# EAGLE schematic RGB_IR_J010131revC (EAGLE 7.7.0), part 1 of 2

## Sheet 1 of 4
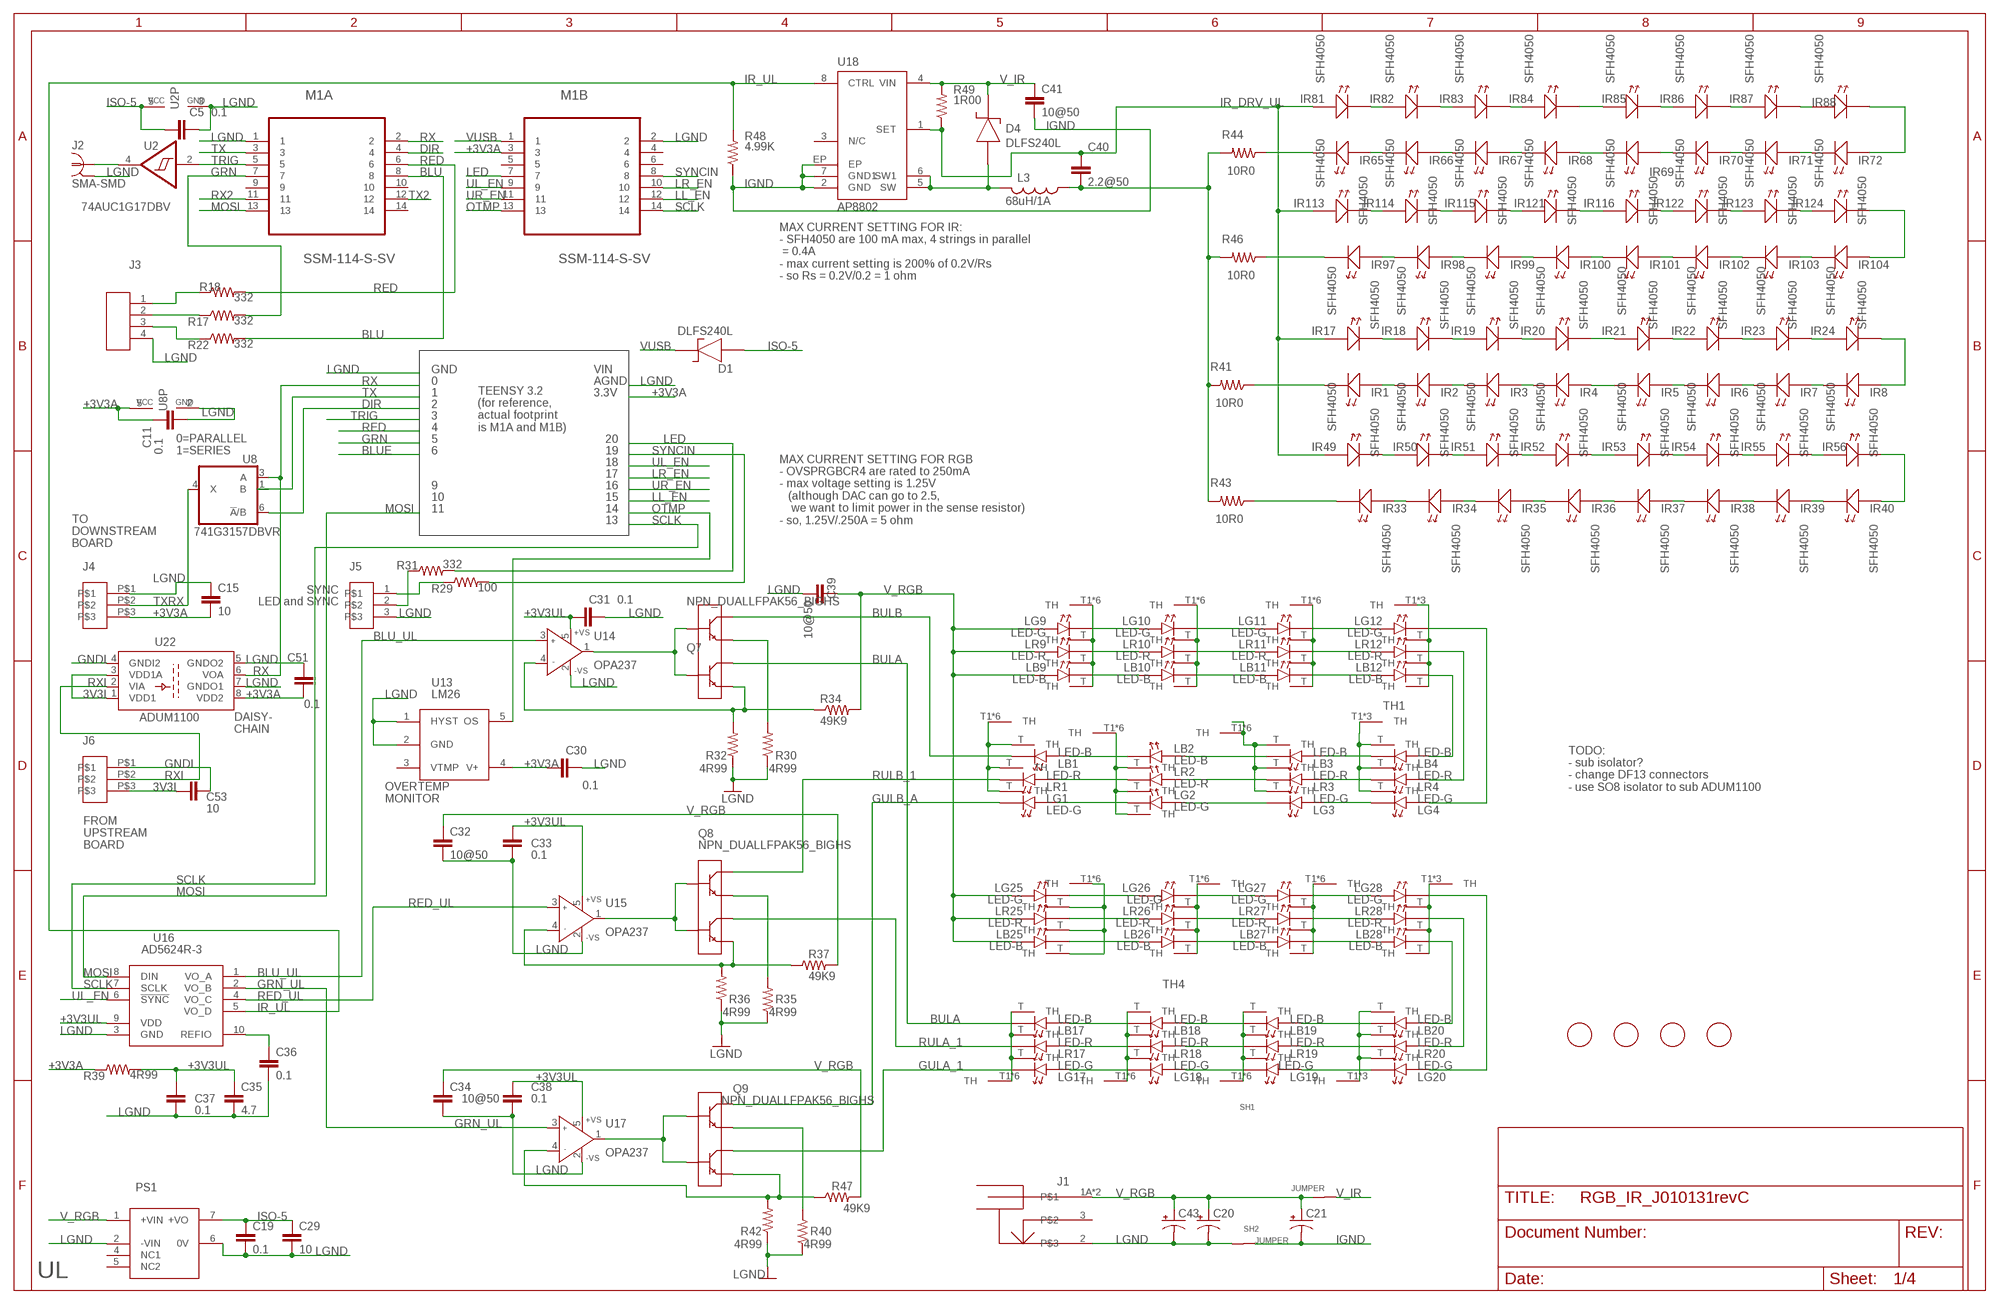
[diagram p0: schematic, sheet 1]

### Parts
C5  0.1  CAPS0603S  [0603S]
C11  0.1  CAPS0603S  [0603S]
C15  10  CAPS1210S  [1210S]
C19  0.1  CAPS0603S  [0603S]
C20  CPOL-US153CLV-0810  [153CLV-0810]
C21  CPOL-US153CLV-0810  [153CLV-0810]
C29  10  CAPS1210S  [1210S]
C30  0.1  CAPS0603S  [0603S]
C31  0.1  CAPS0603S  [0603S]
C32  10@50  CAPS1210S  [1210S]
C33  0.1  CAPS0603S  [0603S]
C34  10@50  CAPS1210S  [1210S]
C35  4.7  CAPS0805S  [0805S]
C36  0.1  CAPS0603S  [0603S]
C37  0.1  CAPS0603S  [0603S]
C38  0.1  CAPS0603S  [0603S]
C39  10@50  CAPS1210S  [1210S]
C40  2.2@50  CAPS1206S  [1206S]
C41  10@50  CAPS1210S  [1210S]
C43  CPOL-US153CLV-0810  [153CLV-0810]
C51  0.1  CAPS0603S  [0603S]
C53  10  CAPS1210S  [1210S]
D1  DLFS240L  DIODE_SCHOTTKYPWRDI-123  [PWRDI-123]
D4  DLFS240L  DIODE_SCHOTTKYPWRDI-123  [PWRDI-123]
FID1  FIDUCIAL  [FIDUCIAL_1MM]
FID2  FIDUCIAL  [FIDUCIAL_1MM]
FID3  FIDUCIAL  [FIDUCIAL_1MM]
FID4  FIDUCIAL  [FIDUCIAL_1MM]
IR1  SFH4050  LEDLED_SFH4050_A  [LED_SFH4045_HEAT_A]
IR2  SFH4050  LEDLED_SFH4050_HEAT  [LED_SFH4050_HEAT]
IR3  SFH4050  LEDLED_SFH4050_HEAT  [LED_SFH4050_HEAT]
IR4  SFH4050  LEDLED_SFH4050_HEAT  [LED_SFH4050_HEAT]
IR5  SFH4050  LEDLED_SFH4050_HEAT  [LED_SFH4050_HEAT]
IR6  SFH4050  LEDLED_SFH4050_HEAT  [LED_SFH4050_HEAT]
IR7  SFH4050  LEDLED_SFH4050_HEAT  [LED_SFH4050_HEAT]
IR8  SFH4050  LEDLED_SFH4050_HEAT  [LED_SFH4050_HEAT]
IR17  SFH4050  LEDLED_SFH4050_HEAT  [LED_SFH4050_HEAT]
IR18  SFH4050  LEDLED_SFH4050_HEAT  [LED_SFH4050_HEAT]
IR19  SFH4050  LEDLED_SFH4050_HEAT  [LED_SFH4050_HEAT]
IR20  SFH4050  LEDLED_SFH4050_HEAT  [LED_SFH4050_HEAT]
IR21  SFH4050  LEDLED_SFH4050_HEAT  [LED_SFH4050_HEAT]
IR22  SFH4050  LEDLED_SFH4050_HEAT  [LED_SFH4050_HEAT]
IR23  SFH4050  LEDLED_SFH4050_HEAT  [LED_SFH4050_HEAT]
IR24  SFH4050  LEDLED_SFH4050_HEAT  [LED_SFH4050_HEAT]
IR33  SFH4050  LEDLED_SFH4050_HEAT  [LED_SFH4050_HEAT]
IR34  SFH4050  LEDLED_SFH4050_HEAT  [LED_SFH4050_HEAT]
IR35  SFH4050  LEDLED_SFH4050_HEAT  [LED_SFH4050_HEAT]
IR36  SFH4050  LEDLED_SFH4050_HEAT  [LED_SFH4050_HEAT]
IR37  SFH4050  LEDLED_SFH4050_HEAT  [LED_SFH4050_HEAT]
IR38  SFH4050  LEDLED_SFH4050_HEAT  [LED_SFH4050_HEAT]
IR39  SFH4050  LEDLED_SFH4050_HEAT  [LED_SFH4050_HEAT]
IR40  SFH4050  LEDLED_SFH4050_HEAT  [LED_SFH4050_HEAT]
IR49  SFH4050  LEDLED_SFH4050_HEAT  [LED_SFH4050_HEAT]
IR50  SFH4050  LEDLED_SFH4050_HEAT  [LED_SFH4050_HEAT]
IR51  SFH4050  LEDLED_SFH4050_HEAT  [LED_SFH4050_HEAT]
IR52  SFH4050  LEDLED_SFH4050_HEAT  [LED_SFH4050_HEAT]
IR53  SFH4050  LEDLED_SFH4050_HEAT  [LED_SFH4050_HEAT]
IR54  SFH4050  LEDLED_SFH4050_HEAT  [LED_SFH4050_HEAT]
IR55  SFH4050  LEDLED_SFH4050_HEAT  [LED_SFH4050_HEAT]
IR56  SFH4050  LEDLED_SFH4050_HEAT  [LED_SFH4050_HEAT]
IR65  SFH4050  LEDLED_SFH4050_HEAT  [LED_SFH4050_HEAT]
IR66  SFH4050  LEDLED_SFH4050_HEAT  [LED_SFH4050_HEAT]
IR67  SFH4050  LEDLED_SFH4050_HEAT  [LED_SFH4050_HEAT]
IR68  SFH4050  LEDLED_SFH4050_HEAT  [LED_SFH4050_HEAT]
IR69  SFH4050  LEDLED_SFH4050_HEAT  [LED_SFH4050_HEAT]
IR70  SFH4050  LEDLED_SFH4050_HEAT  [LED_SFH4050_HEAT]
IR71  SFH4050  LEDLED_SFH4050_HEAT  [LED_SFH4050_HEAT]
IR72  SFH4050  LEDLED_SFH4050_HEAT  [LED_SFH4050_HEAT]
IR81  SFH4050  LEDLED_SFH4050_HEAT  [LED_SFH4050_HEAT]
IR82  SFH4050  LEDLED_SFH4050_HEAT  [LED_SFH4050_HEAT]
IR83  SFH4050  LEDLED_SFH4050_HEAT  [LED_SFH4050_HEAT]
IR84  SFH4050  LEDLED_SFH4050_HEAT  [LED_SFH4050_HEAT]
IR85  SFH4050  LEDLED_SFH4050_HEAT  [LED_SFH4050_HEAT]
IR86  SFH4050  LEDLED_SFH4050_HEAT  [LED_SFH4050_HEAT]
IR87  SFH4050  LEDLED_SFH4050_HEAT  [LED_SFH4050_HEAT]
IR88  SFH4050  LEDLED_SFH4050_HEAT  [LED_SFH4050_HEAT]
IR97  SFH4050  LEDLED_SFH4050_HEAT  [LED_SFH4050_HEAT]
IR98  SFH4050  LEDLED_SFH4050_HEAT  [LED_SFH4050_HEAT]
IR99  SFH4050  LEDLED_SFH4050_HEAT  [LED_SFH4050_HEAT]
IR100  SFH4050  LEDLED_SFH4050_HEAT  [LED_SFH4050_HEAT]
IR101  SFH4050  LEDLED_SFH4050_HEAT  [LED_SFH4050_HEAT]
IR102  SFH4050  LEDLED_SFH4050_HEAT  [LED_SFH4050_HEAT]
IR103  SFH4050  LEDLED_SFH4050_HEAT  [LED_SFH4050_HEAT]
IR104  SFH4050  LEDLED_SFH4050_HEAT  [LED_SFH4050_HEAT]
IR113  SFH4050  LEDLED_SFH4050_HEAT  [LED_SFH4050_HEAT]
IR114  SFH4050  LEDLED_SFH4050_HEAT  [LED_SFH4050_HEAT]
IR115  SFH4050  LEDLED_SFH4050_HEAT  [LED_SFH4050_HEAT]
IR116  SFH4050  LEDLED_SFH4050_HEAT  [LED_SFH4050_HEAT]
IR121  SFH4050  LEDLED_SFH4050_HEAT  [LED_SFH4050_HEAT]
IR122  SFH4050  LEDLED_SFH4050_HEAT  [LED_SFH4050_HEAT]
IR123  SFH4050  LEDLED_SFH4050_HEAT  [LED_SFH4050_HEAT]
IR124  SFH4050  LEDLED_SFH4050  [LED_SFH4050]
J1  POWER_JACK_SHUNTPJ-002  [PJ-002]
J2  SMA-SMD  [SMA-SMD]
J3  CON4MOLEX_1.25  [MOLEX_1.25-4]
J4  CON3TE-3-SM-V  [TE-3-SM-V]
J5  CON3MOLEX_1.25-3  [MOLEX_1.25-3]
J6  CON3TE-3-SM-V  [TE-3-SM-V]
L3  68uH/1A  INDUCTOR_SMSRU8043  [SRU8043]
LB1  LED-B  LED-TH  [SUNPLUS-LED]
LB2  LED-B  LED-TH  [SUNPLUS-LED]
LB3  LED-B  LED-TH  [SUNPLUS-LED]
LB4  LED-B  LED-TH  [SUNPLUS-LED]
LB9  LED-B  LED-TH  [SUNPLUS-LED]
LB10  LED-B  LED-TH  [SUNPLUS-LED]
LB11  LED-B  LED-TH  [SUNPLUS-LED]
LB12  LED-B  LED-TH  [SUNPLUS-LED]
LB17  LED-B  LED-TH  [SUNPLUS-LED]
LB18  LED-B  LED-TH  [SUNPLUS-LED]
LB19  LED-B  LED-TH  [SUNPLUS-LED]
LB20  LED-B  LED-TH  [SUNPLUS-LED]
LB25  LED-B  LED-TH  [SUNPLUS-LED]
LB26  LED-B  LED-TH  [SUNPLUS-LED]
LB27  LED-B  LED-TH  [SUNPLUS-LED]
LB28  LED-B  LED-TH  [SUNPLUS-LED]
LG1  LED-G  LED-TH  [SUNPLUS-LED]
LG2  LED-G  LED-TH  [SUNPLUS-LED]
LG3  LED-G  LED-TH  [SUNPLUS-LED]
LG4  LED-G  LED-TH  [SUNPLUS-LED]
LG9  LED-G  LED-TH  [SUNPLUS-LED]
LG10  LED-G  LED-TH  [SUNPLUS-LED]
LG11  LED-G  LED-TH  [SUNPLUS-LED]
LG12  LED-G  LED-TH  [SUNPLUS-LED]
LG17  LED-G  LED-TH  [SUNPLUS-LED]
LG18  LED-G  LED-TH  [SUNPLUS-LED]
LG19  LED-G  LED-TH  [SUNPLUS-LED]
LG20  LED-G  LED-TH  [SUNPLUS-LED]
LG25  LED-G  LED-TH  [SUNPLUS-LED]
LG26  LED-G  LED-TH  [SUNPLUS-LED]
LG27  LED-G  LED-TH  [SUNPLUS-LED]
LG28  LED-G  LED-TH  [SUNPLUS-LED]
LR1  LED-R  LED-TH  [SUNPLUS-LED]
LR2  LED-R  LED-TH  [SUNPLUS-LED]
LR3  LED-R  LED-TH  [SUNPLUS-LED]
LR4  LED-R  LED-TH  [SUNPLUS-LED]
LR9  LED-R  LED-TH  [SUNPLUS-LED]
LR10  LED-R  LED-TH  [SUNPLUS-LED]
LR11  LED-R  LED-TH  [SUNPLUS-LED]
LR12  LED-R  LED-TH  [SUNPLUS-LED]
LR17  LED-R  LED-TH  [SUNPLUS-LED]
LR18  LED-R  LED-TH  [SUNPLUS-LED]
LR19  LED-R  LED-TH  [SUNPLUS-LED]
LR20  LED-R  LED-TH  [SUNPLUS-LED]
LR25  LED-R  LED-TH  [SUNPLUS-LED]
LR26  LED-R  LED-TH  [SUNPLUS-LED]
LR27  LED-R  LED-TH  [SUNPLUS-LED]
LR28  LED-R  LED-TH  [SUNPLUS-LED]
M1A  SSM-114-S-SV  [SAMTEC_SSM-114-S-SV]
M1B  SSM-114-S-SV  [SAMTEC_SSM-114-S-SV]
PS1  DC-DCISLTDN-5W  [DC-DC-TDN-5W]
Q7  NPN_DUALLFPAK56_BIGHS  [LFPAK56_HS2]
Q8  NPN_DUALLFPAK56_BIGHS  [LFPAK56_HS2]
Q9  NPN_DUALLFPAK56_BIGHS  [LFPAK56_HS2]
R17  332  RESISTOR_SM0805S  [0805S]
R18  332  RESISTOR_SM0805S  [0805S]
R22  332  RESISTOR_SM0805S  [0805S]
R29  100  RESISTOR_SM0805S  [0805S]
R30  4R99  RESISTOR-POWER1812  [1812]
R31  332  RESISTOR_SM0805S  [0805S]
R32  4R99  RESISTOR-POWER1812  [1812]
R34  49K9  RESISTOR_SM1206S  [1206S]
R35  4R99  RESISTOR-POWER1812  [1812]
R36  4R99  RESISTOR-POWER1812  [1812]
R37  49K9  RESISTOR_SM1206S  [1206S]
R39  4R99  RESISTOR_SM0805S  [0805S]
R40  4R99  RESISTOR-POWER1812  [1812]
R41  10R0  RESISTOR_SM1206S  [1206S]
R42  4R99  RESISTOR-POWER1812  [1812]
R43  10R0  RESISTOR_SM1206S  [1206S]
R44  10R0  RESISTOR_SM1206S  [1206S]
R46  10R0  RESISTOR_SM1206S  [1206S]
R47  49K9  RESISTOR_SM1206S  [1206S]
R48  4.99K  RESISTOR_SM0805S  [0805S]
R49  1R00  RESISTOR_SM1206S  [1206S]
SH1  JUMPER  [JUMPER]
SH2  JUMPER  [JUMPER]
U2  74AUC1G17DBV  [SOT23-5]
U8  741G3157DBVR  [DBV_R-PDSO-G6]
U13  LM26  [SOT23-5]
U14  OPA237  AD8065RT  [SOT23-5]
U15  OPA237  AD8065RT  [SOT23-5]
U16  AD5624R-3  AD56X4R  [MSOP10]
U17  OPA237  AD8065RT  [SOT23-5]
U18  AP8802  [SOIC8-EP]
U22  ADUM1100  [SOIC8]
V1  HS  SUNPLUS-VIAS-ONLY  [SUNPLUS-VIAS-ONLY]
V2  HS  SUNPLUS-VIAS-ONLY  [SUNPLUS-VIAS-ONLY]
V3  HS  SUNPLUS-VIAS-ONLY  [SUNPLUS-VIAS-ONLY]
V4  HS  SUNPLUS-VIAS-ONLYTOPVIAS  [SUNPLUS-TOP-VIAS-ONLY]
V9  SUNPLUS-VIAS-ONLY  [SUNPLUS-VIAS-ONLY]
V10  HS  SUNPLUS-VIAS-ONLY  [SUNPLUS-VIAS-ONLY]
V11  HS  SUNPLUS-VIAS-ONLY  [SUNPLUS-VIAS-ONLY]
V12  HS  SUNPLUS-VIAS-ONLYTOPVIAS  [SUNPLUS-TOP-VIAS-ONLY]
V17  SUNPLUS-VIAS-ONLY  [SUNPLUS-VIAS-ONLY]
V18  SUNPLUS-VIAS-ONLY  [SUNPLUS-VIAS-ONLY]
V19  SUNPLUS-VIAS-ONLY  [SUNPLUS-VIAS-ONLY]
V20  SUNPLUS-VIAS-ONLYTOPVIAS  [SUNPLUS-TOP-VIAS-ONLY]
V25  SUNPLUS-VIAS-ONLY  [SUNPLUS-VIAS-ONLY]
V26  SUNPLUS-VIAS-ONLY  [SUNPLUS-VIAS-ONLY]
V27  SUNPLUS-VIAS-ONLY  [SUNPLUS-VIAS-ONLY]
V28  SUNPLUS-VIAS-ONLYTOPVIAS  [SUNPLUS-TOP-VIAS-ONLY]

### Nets
3V3I: C53.1 J6.P$3 U22.1(VDD1) U22.3(VDD1A)
+3V3A: C11.1 C15.2 C30.1 C51.1 J4.P$3 M1B.3 R39.1 U8.5(VCC) U13.4(V+) U22.8(VDD2) ; also sheet 2,3,4
+3V3UL: C31.1 C33.1 C35.1 C37.1 C38.1 R39.2 U14.5(+VS) U15.5(+VS) U16.9(VDD) U17.5(+VS)
BLU: M1A.8 R22.2
BLU_UL: U14.3(IN+) U16.1(VO_A)
BULA: LB17.GC(K) Q7.5(C2) Q7.5A1(C2) Q7.5A(C2) Q7.5B(C2) Q7.5C1(C2) Q7.5C2(C2) Q7.5C(C2) Q7.6(C2) Q7.56(C2) Q7.56A(C2) Q7.56B(C2)
BULB: LB1.GC(K) Q7.7(C1) Q7.8(C1) Q7.8A(C1) Q7.8B(C1) Q7.8C1(C1) Q7.8C2(C1) Q7.8C3(C1) Q7.8C(C1) Q7.78(C1) Q7.78A(C1) Q7.78B(C1)
DIR: M1A.4 U8.6(!A!/B)
GNDI: C53.2 J6.P$1 U22.4(GNDI2)
GRN: M1A.7 R17.2
GRN_UL: U16.2(VO_B) U17.3(IN+)
GULA_1: LG17.GC(K) Q9.5(C2) Q9.5A1(C2) Q9.5A(C2) Q9.5B(C2) Q9.5C1(C2) Q9.5C2(C2) Q9.5C(C2) Q9.6(C2) Q9.56(C2) Q9.56A(C2) Q9.56B(C2)
GULB_A: LG1.GC(K) Q9.7(C1) Q9.8(C1) Q9.8A(C1) Q9.8B(C1) Q9.8C1(C1) Q9.8C2(C1) Q9.8C3(C1) Q9.8C(C1) Q9.78(C1) Q9.78A(C1) Q9.78B(C1)
IGND: C21.- C41.2 R48.1 SH2.2 U18.2(GND) U18.7(GND1) U18.EP ; also sheet 2,3,4
IR_DRV_UL: C40.1 IR17.A IR17.A1(A) IR49.A IR49.A1(A) IR81.A IR81.A1(A) IR113.A IR113.A1(A) R49.1 U18.1(SET)
IR_RET_UL: C40.2 L3.1 R41.2 R43.2 R44.2 R46.2
IR_UL: R48.2 U16.5(VO_D) U18.8(CTRL)
ISO-5: C5.1 C19.1 C29.1 D1.A PS1.7(+VO) U2.5(VCC)
LED: M1B.7 R31.2
LGND: C5.2 C11.2 C15.1 C19.2 C20.- C29.2 C30.2 C31.2 C32.2 C33.2 C34.2 C35.2 C36.2 C37.2 C38.2 C39.2 C43.- C51.2 J1.2 J2.2@1 J2.2@2 J2.2@3 J2.2@4 J2.2@5 J2.2@6 J3.4 J4.P$1 J5.3 M1A.1 M1B.2 PS1.2(-VIN) PS1.6(0V) R30.1 R32.1 R35.1 R36.1 R40.1 R42.1 SH2.1 U2.3(GND) U8.2(GND) U13.1(HYST) U13.2(GND) U14.2(-VS) U15.2(-VS) U16.3(GND) U17.2(-VS) U22.5(GNDO2) U22.7(GNDO1) ; also sheet 2,3,4
LL_EN: M1B.12 ; also sheet 2
LR_EN: M1B.10 ; also sheet 4
MOSI: M1A.13 U16.8(DIN) ; also sheet 2,3,4
N$1: IR7.A IR7.A1(A) IR8.C1(K) IR8.C(K)
N$2: IR6.A IR6.A1(A) IR7.C1(K) IR7.C(K)
N$3: IR71.A IR71.A1(A) IR72.C1(K) IR72.C(K)
N$4: IR70.A IR70.A1(A) IR71.C1(K) IR71.C(K)
N$5: IR69.A IR69.A1(A) IR70.C1(K) IR70.C(K)
N$6: IR67.A IR67.A1(A) IR68.C1(K) IR68.C(K)
N$7: IR66.A IR66.A1(A) IR67.C1(K) IR67.C(K)
N$8: IR65.A IR65.A1(A) IR66.C1(K) IR66.C(K)
N$9: IR5.A IR5.A1(A) IR6.C1(K) IR6.C(K)
N$10: IR3.A IR3.A1(A) IR4.C1(K) IR4.C(K)
N$11: IR2.A IR2.A1(A) IR3.C1(K) IR3.C(K)
N$12: IR1.A IR1.A1(A) IR2.C1(K) IR2.C(K)
N$13: IR17.C1(K) IR17.C(K) IR18.A IR18.A1(A)
N$14: IR81.C1(K) IR81.C(K) IR82.A IR82.A1(A)
N$15: IR18.C1(K) IR18.C(K) IR19.A IR19.A1(A)
N$16: IR82.C1(K) IR82.C(K) IR83.A IR83.A1(A)
N$17: IR83.C1(K) IR83.C(K) IR84.A IR84.A1(A)
N$18: IR68.A IR68.A1(A) IR69.C1(K) IR69.C(K)
N$19: IR103.A IR103.A1(A) IR104.C1(K) IR104.C(K)
N$20: IR102.A IR102.A1(A) IR103.C1(K) IR103.C(K)
N$21: IR101.A IR101.A1(A) IR102.C1(K) IR102.C(K)
N$22: IR100.A IR100.A1(A) IR101.C1(K) IR101.C(K)
N$23: IR99.A IR99.A1(A) IR100.C1(K) IR100.C(K)
N$24: IR19.C1(K) IR19.C(K) IR20.A IR20.A1(A)
N$25: IR4.A IR4.A1(A) IR5.C1(K) IR5.C(K)
N$26: IR39.A IR39.A1(A) IR40.C1(K) IR40.C(K)
N$27: IR38.A IR38.A1(A) IR39.C1(K) IR39.C(K)
N$28: IR37.A IR37.A1(A) IR38.C1(K) IR38.C(K)
N$29: IR98.A IR98.A1(A) IR99.C1(K) IR99.C(K)
N$30: IR36.A IR36.A1(A) IR37.C1(K) IR37.C(K)
N$31: IR35.A IR35.A1(A) IR36.C1(K) IR36.C(K)
N$32: IR97.A IR97.A1(A) IR98.C1(K) IR98.C(K)
N$33: IR85.C1(K) IR85.C(K) IR86.A IR86.A1(A)
N$34: IR86.C1(K) IR86.C(K) IR87.A IR87.A1(A)
N$35: IR34.A IR34.A1(A) IR35.C1(K) IR35.C(K)
N$36: IR87.C1(K) IR87.C(K) IR88.A IR88.A1(A)
N$37: IR33.A IR33.A1(A) IR34.C1(K) IR34.C(K)
N$38: IR21.C1(K) IR21.C(K) IR22.A IR22.A1(A)
N$39: IR22.C1(K) IR22.C(K) IR23.A IR23.A1(A)
N$40: IR23.C1(K) IR23.C(K) IR24.A IR24.A1(A)
N$41: IR49.C1(K) IR49.C(K) IR50.A IR50.A1(A)
N$42: IR50.C1(K) IR50.C(K) IR51.A IR51.A1(A)
N$43: IR51.C1(K) IR51.C(K) IR52.A IR52.A1(A)
N$44: IR53.C1(K) IR53.C(K) IR54.A IR54.A1(A)
N$45: IR54.C1(K) IR54.C(K) IR55.A IR55.A1(A)
N$46: IR55.C1(K) IR55.C(K) IR56.A IR56.A1(A)
N$47: IR113.C1(K) IR113.C(K) IR114.A IR114.A1(A)
N$48: IR20.C1(K) IR20.C(K) IR21.A IR21.A1(A)
N$49: IR114.C1(K) IR114.C(K) IR115.A IR115.A1(A)
N$50: IR8.A IR8.A1(A) IR24.C1(K) IR24.C(K)
N$51: IR52.C1(K) IR52.C(K) IR53.A IR53.A1(A)
N$52: IR115.C1(K) IR115.C(K) IR121.A IR121.A1(A)
N$53: IR1.C(K) R41.1
N$54: IR40.A IR40.A1(A) IR56.C1(K) IR56.C(K)
N$55: IR33.C1(K) IR33.C(K) R43.1
N$56: LG9.GC(K) LG10.GA(A)
N$57: LR9.GC(K) LR10.GA(A)
N$58: IR65.C1(K) IR65.C(K) R44.1
N$60: LB9.GC(K) LB10.GA(A)
N$61: IR116.C1(K) IR116.C(K) IR122.A IR122.A1(A)
N$63: LG10.GC(K) LG11.GA(A)
N$64: IR122.C1(K) IR122.C(K) IR123.A IR123.A1(A)
N$65: IR123.C1(K) IR123.C(K) IR124.A
N$66: Q8.3(E2) R36.2 R37.1 U15.4(IN-)
N$67: D4.A L3.2 U18.5(SW) U18.6(SW1)
N$68: IR84.C1(K) IR84.C(K) IR85.A IR85.A1(A)
N$69: LR10.GC(K) LR11.GA(A)
N$70: IR72.A IR72.A1(A) IR88.C1(K) IR88.C(K)
N$71: C36.1 U16.10(REFIO)
N$72: IR116.A IR116.A1(A) IR121.C1(K) IR121.C(K)
N$73: LB10.GC(K) LB11.GA(A)
N$74: LG11.GC(K) LG12.GA(A)
N$75: IR104.A IR104.A1(A) IR124.C(K)
N$77: LR11.GC(K) LR12.GA(A)
N$78: IR97.C1(K) IR97.C(K) R46.1
N$79: Q9.3(E2) R42.2 R47.1 U17.4(IN-)
N$80: LB11.GC(K) LB12.GA(A)
N$81: LG4.GA(A) LG12.GC(K)
N$82: Q8.1(E1) R35.2
N$83: LR4.GA(A) LR12.GC(K)
N$84: Q8.2(B1) Q8.4(B2) U15.1(OUT)
N$85: LB4.GA(A) LB12.GC(K)
N$86: LB2.GA(A) LB3.GC(K)
N$87: LR2.GA(A) LR3.GC(K)
N$88: LG2.GA(A) LG3.GC(K)
N$89: LB1.GA(A) LB2.GC(K)
N$91: LR1.GA(A) LR2.GC(K)
N$92: LG1.GA(A) LG2.GC(K)
N$93: LG3.GA(A) LG4.GC(K)
N$94: LR3.GA(A) LR4.GC(K)
N$95: LB3.GA(A) LB4.GC(K)
N$97: Q9.2(B1) Q9.4(B2) U17.1(OUT)
N$99: LG25.GC(K) LG26.GA(A)
N$100: LR25.GC(K) LR26.GA(A)
N$101: LB25.GC(K) LB26.GA(A)
N$102: LG26.GC(K) LG27.GA(A)
N$103: LR26.GC(K) LR27.GA(A)
N$104: LB26.GC(K) LB27.GA(A)
N$105: LG27.GC(K) LG28.GA(A)
N$106: LR27.GC(K) LR28.GA(A)
N$107: LB27.GC(K) LB28.GA(A)
N$108: LG20.GA(A) LG28.GC(K)
N$109: LR20.GA(A) LR28.GC(K)
N$110: LB20.GA(A) LB28.GC(K)
N$111: LG19.GA(A) LG20.GC(K)
N$112: LR19.GA(A) LR20.GC(K)
N$113: LB19.GA(A) LB20.GC(K)
N$114: LG18.GA(A) LG19.GC(K)
N$115: LR18.GA(A) LR19.GC(K)
N$116: LB18.GA(A) LB19.GC(K)
N$117: LG17.GA(A) LG18.GC(K)
N$118: LR17.GA(A) LR18.GC(K)
N$119: LB17.GA(A) LB18.GC(K)
N$120: Q7.2(B1) Q7.4(B2) U14.1(OUT)
N$121: J3.3 R22.1
N$123: Q7.1(E1) R30.2
N$124: J2.1 U2.4(O)
N$125: Q9.1(E1) R40.2
N$208: Q7.3(E2) R32.2 R34.1 U14.4(IN-)
N$218: J3.2 R17.1
N$221: J3.1 R18.1
N$244: LB9.T(TH) LG9.T(TH) LR9.T(TH) V9.T1(TH) V9.T2(TH) V9.T3(TH) V9.T4(TH) V9.T5(TH) V9.T6(TH)
N$337: LB10.T(TH) LG10.T(TH) LR10.T(TH) V10.T1(TH) V10.T2(TH) V10.T3(TH) V10.T4(TH) V10.T5(TH) V10.T6(TH)
N$347: LB11.T(TH) LG11.T(TH) LR11.T(TH) V11.T1(TH) V11.T2(TH) V11.T3(TH) V11.T4(TH) V11.T5(TH) V11.T6(TH)
N$350: LB1.T(TH) LG1.T(TH) LR1.T(TH) V1.T1(TH) V1.T2(TH) V1.T3(TH) V1.T4(TH) V1.T5(TH) V1.T6(TH)
N$373: LB4.T(TH) LG4.T(TH) LR4.T(TH) V4.T1(TH) V4.T2(TH) V4.T3(TH)
N$376: J5.2 R31.1
N$377: LB25.T(TH) LG25.T(TH) LR25.T(TH) V25.T1(TH) V25.T2(TH) V25.T3(TH) V25.T4(TH) V25.T5(TH) V25.T6(TH)
N$379: LB27.T(TH) LG27.T(TH) LR27.T(TH) V27.T1(TH) V27.T2(TH) V27.T3(TH) V27.T4(TH) V27.T5(TH) V27.T6(TH)
N$459: LB26.T(TH) LG26.T(TH) LR26.T(TH) V26.T1(TH) V26.T2(TH) V26.T3(TH) V26.T4(TH) V26.T5(TH) V26.T6(TH)
N$469: LB20.T(TH) LG20.T(TH) LR20.T(TH) V20.T1(TH) V20.T2(TH) V20.T3(TH)
N$472: LB19.T(TH) LG19.T(TH) LR19.T(TH) V19.T1(TH) V19.T2(TH) V19.T3(TH) V19.T4(TH) V19.T5(TH) V19.T6(TH)
N$495: LB17.T(TH) LG17.T(TH) LR17.T(TH) V17.T1(TH) V17.T2(TH) V17.T3(TH) V17.T4(TH) V17.T5(TH) V17.T6(TH)
N$600: LB2.T(TH) LG2.T(TH) LR2.T(TH) V2.T1(TH) V2.T2(TH) V2.T3(TH) V2.T4(TH) V2.T5(TH) V2.T6(TH)
OTMP: M1B.13 U13.5(OS)
RED: M1A.6 R18.2
RED_UL: U15.3(IN+) U16.4(VO_C)
RULA_1: LR17.GC(K) Q8.5(C2) Q8.5A1(C2) Q8.5A(C2) Q8.5B(C2) Q8.5C1(C2) Q8.5C2(C2) Q8.5C(C2) Q8.6(C2) Q8.56(C2) Q8.56A(C2) Q8.56B(C2)
RULB_1: LR1.GC(K) Q8.7(C1) Q8.8(C1) Q8.8A(C1) Q8.8B(C1) Q8.8C1(C1) Q8.8C2(C1) Q8.8C3(C1) Q8.8C(C1) Q8.78(C1) Q8.78A(C1) Q8.78B(C1)
RX: M1A.2 U8.3(A) U22.6(VOA)
RX2: M1A.11
RXI: J6.P$2 U22.2(VIA)
SCLK: M1B.14 U16.7(SCLK) ; also sheet 2,3,4
SYNC: J5.1 R29.1
SYNCIN: M1B.8 R29.2
TH1: LB12.T(TH) LG12.T(TH) LR12.T(TH) V12.T1(TH) V12.T2(TH) V12.T3(TH)
TH2: LB3.T(TH) LG3.T(TH) LR3.T(TH) V3.T1(TH) V3.T2(TH) V3.T3(TH) V3.T4(TH) V3.T5(TH) V3.T6(TH)
TH3: LB28.T(TH) LG28.T(TH) LR28.T(TH) V28.T1(TH) V28.T2(TH) V28.T3(TH)
TH4: LB18.T(TH) LG18.T(TH) LR18.T(TH) V18.T1(TH) V18.T2(TH) V18.T3(TH) V18.T4(TH) V18.T5(TH) V18.T6(TH)
TRIG: M1A.5 U2.2(I)
TX: M1A.3 U8.1(B)
TX2: M1A.12
TXRX: J4.P$2 U8.4(X)
UL_EN: M1B.9 U16.6(!SYNC)
UR_EN: M1B.11 ; also sheet 3
V_IR: C41.1 D4.K R49.2 SH1.1 U18.4(VIN) ; also sheet 2,3,4
V_RGB: C20.+ C21.+ C32.1 C34.1 C39.1 C43.+ J1.1A J1.1B LB9.GA(A) LB25.GA(A) LG9.GA(A) LG25.GA(A) LR9.GA(A) LR25.GA(A) PS1.1(+VIN) R34.2 R37.2 R47.2 SH1.2 ; also sheet 2,3,4
VUSB: D1.K M1B.1
Unconnected: J1.3 M1A.9 M1A.10 M1A.14 M1B.4 M1B.5 M1B.6 PS1.4(NC1) PS1.5(NC2) U13.3(VTMP) U18.3(N/C)

### Notes on the sheet
- MAX CURRENT SETTING FOR IR:
  - SFH4050 are 100 mA max, 4 strings in parallel
   = 0.4A
  - max current setting is 200% of 0.2V/Rs
  - so Rs = 0.2V/0.2 = 1 ohm
- GND | VIN
- 0 | AGND
- 1 | 3.3V
- 2
- 3
- 4
- TEENSY 3.2
  (for reference,
  actual footprint
  is M1A and M1B)
- 5 | 20
- 0=PARALLEL
  1=SERIES
- 6 | 19
- 18
- 17
- 9 | 16
- 10 | 15
- 11 | 14
- 13
- MAX CURRENT SETTING FOR RGB
  - OVSPRGBCR4 are rated to 250mA
  - max voltage setting is 1.25V
     (although DAC can go to 2.5,
      we want to limit power in the sense resistor)
  - so, 1.25V/.250A = 5 ohm
- TO
  DOWNSTREAM
  BOARD
- LED and SYNC
- DAISY-
  CHAIN
- TODO:
  - sub isolator?
  - change DF13 connectors
  - use SO8 isolator to sub ADUM1100
- OVERTEMP
  MONITOR
- FROM
  UPSTREAM
  BOARD
- UL

## Sheet 2 of 4
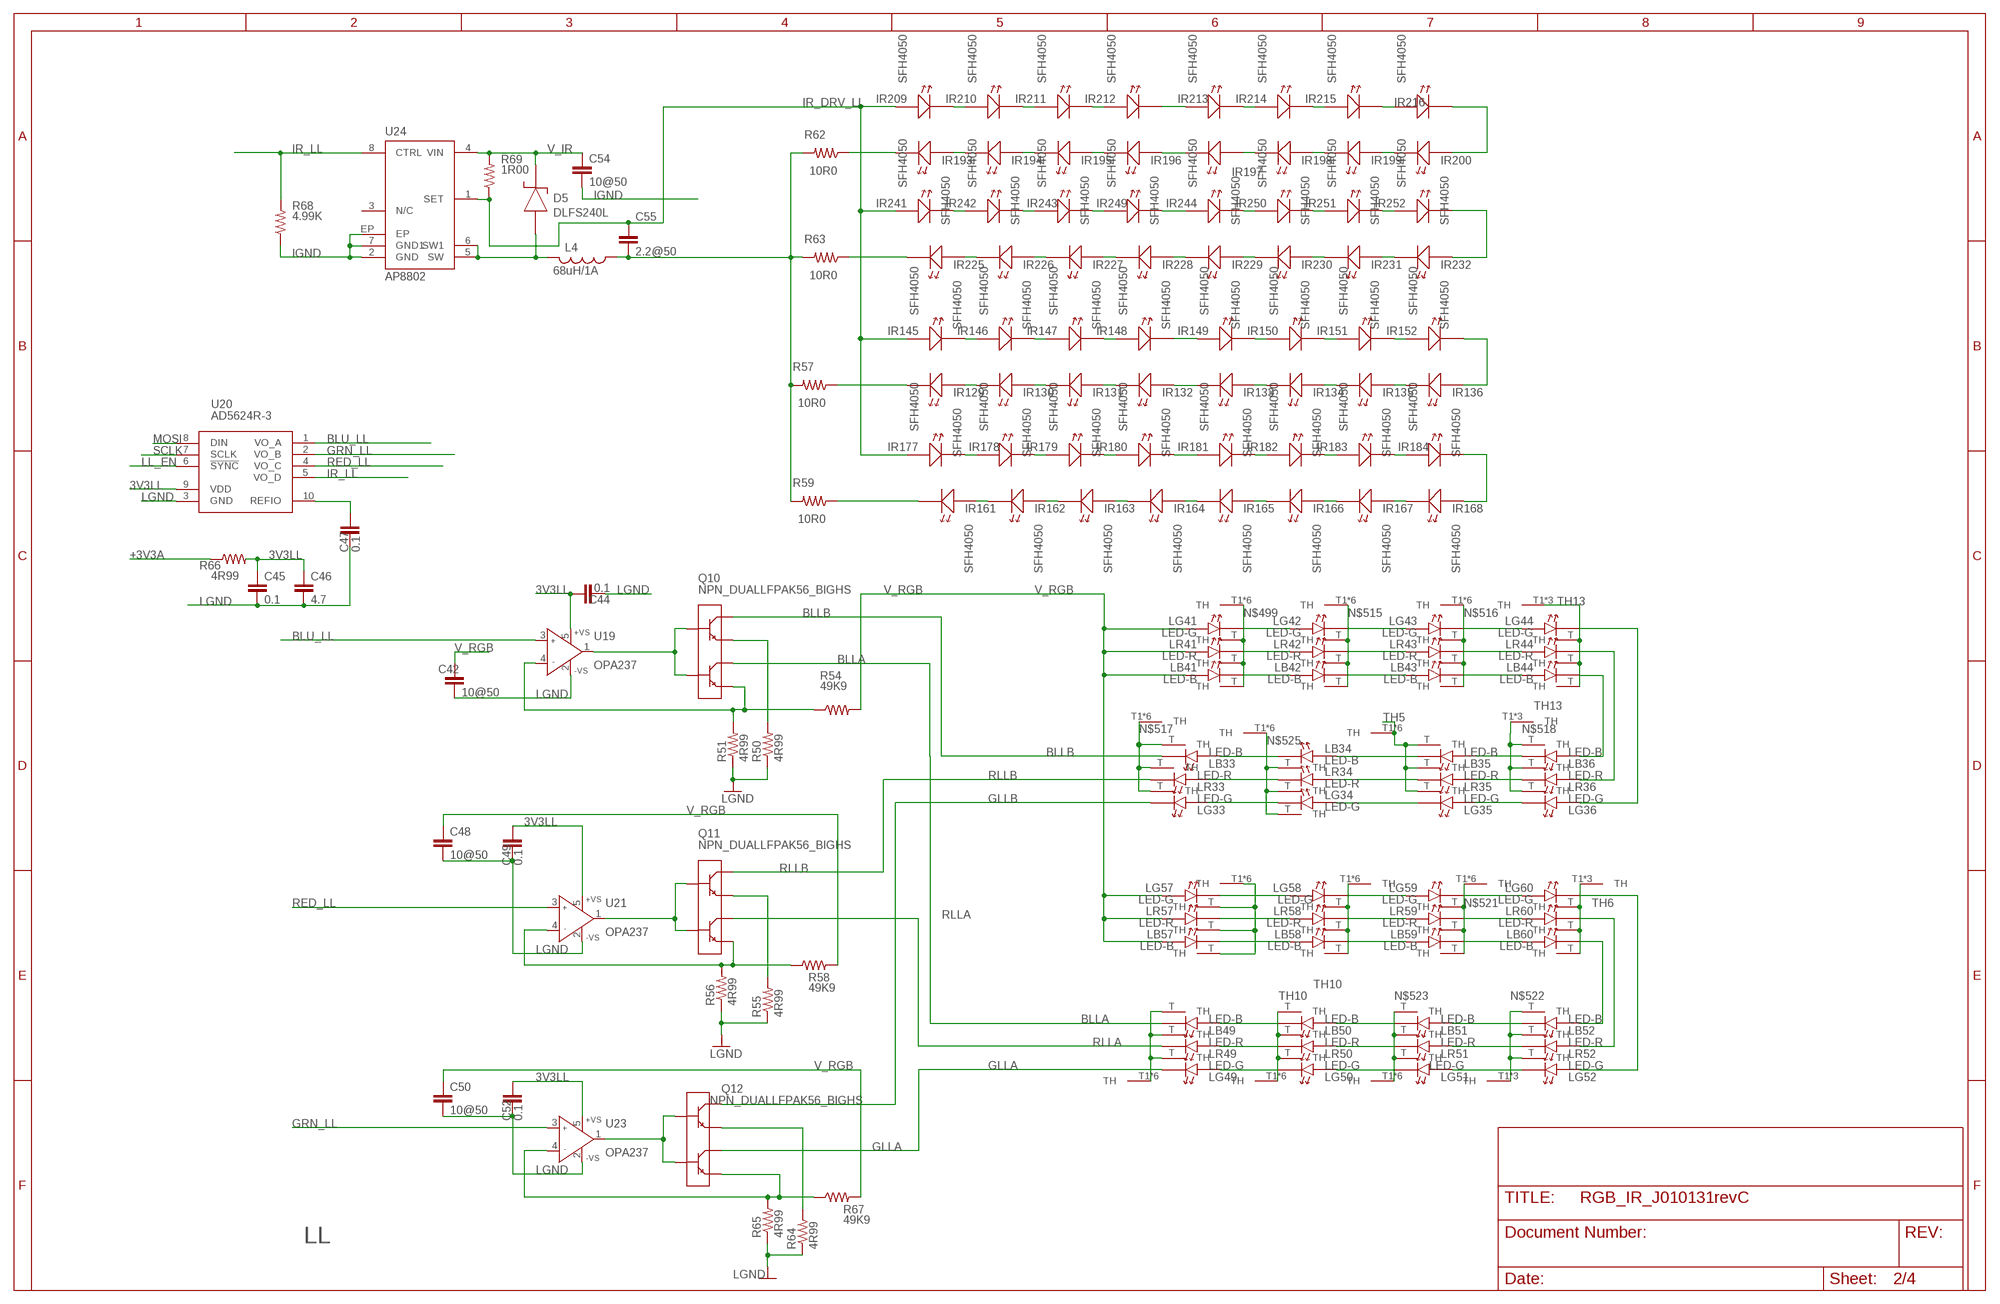
[diagram p1: schematic, sheet 2]

### Parts
C42  10@50  CAPS1210S  [1210S]
C44  0.1  CAPS0603S  [0603S]
C45  0.1  CAPS0603S  [0603S]
C46  4.7  CAPS0805S  [0805S]
C47  0.1  CAPS0603S  [0603S]
C48  10@50  CAPS1210S  [1210S]
C49  0.1  CAPS0603S  [0603S]
C50  10@50  CAPS1210S  [1210S]
C52  0.1  CAPS0603S  [0603S]
C54  10@50  CAPS1210S  [1210S]
C55  2.2@50  CAPS1206S  [1206S]
D5  DLFS240L  DIODE_SCHOTTKYPWRDI-123  [PWRDI-123]
IR129  SFH4050  LEDLED_SFH4050_A  [LED_SFH4045_HEAT_A]
IR130  SFH4050  LEDLED_SFH4050_HEAT  [LED_SFH4050_HEAT]
IR131  SFH4050  LEDLED_SFH4050_HEAT  [LED_SFH4050_HEAT]
IR132  SFH4050  LEDLED_SFH4050_HEAT  [LED_SFH4050_HEAT]
IR133  SFH4050  LEDLED_SFH4050_HEAT  [LED_SFH4050_HEAT]
IR134  SFH4050  LEDLED_SFH4050_HEAT  [LED_SFH4050_HEAT]
IR135  SFH4050  LEDLED_SFH4050_HEAT  [LED_SFH4050_HEAT]
IR136  SFH4050  LEDLED_SFH4050  [LED_SFH4050]
IR145  SFH4050  LEDLED_SFH4050_HEAT  [LED_SFH4050_HEAT]
IR146  SFH4050  LEDLED_SFH4050_HEAT  [LED_SFH4050_HEAT]
IR147  SFH4050  LEDLED_SFH4050_HEAT  [LED_SFH4050_HEAT]
IR148  SFH4050  LEDLED_SFH4050_HEAT  [LED_SFH4050_HEAT]
IR149  SFH4050  LEDLED_SFH4050_HEAT  [LED_SFH4050_HEAT]
IR150  SFH4050  LEDLED_SFH4050_HEAT  [LED_SFH4050_HEAT]
IR151  SFH4050  LEDLED_SFH4050_HEAT  [LED_SFH4050_HEAT]
IR152  SFH4050  LEDLED_SFH4050_HEAT  [LED_SFH4050_HEAT]
IR161  SFH4050  LEDLED_SFH4050_HEAT  [LED_SFH4050_HEAT]
IR162  SFH4050  LEDLED_SFH4050_HEAT  [LED_SFH4050_HEAT]
IR163  SFH4050  LEDLED_SFH4050_HEAT  [LED_SFH4050_HEAT]
IR164  SFH4050  LEDLED_SFH4050_HEAT  [LED_SFH4050_HEAT]
IR165  SFH4050  LEDLED_SFH4050_HEAT  [LED_SFH4050_HEAT]
IR166  SFH4050  LEDLED_SFH4050_HEAT  [LED_SFH4050_HEAT]
IR167  SFH4050  LEDLED_SFH4050_HEAT  [LED_SFH4050_HEAT]
IR168  SFH4050  LEDLED_SFH4050_HEAT  [LED_SFH4050_HEAT]
IR177  SFH4050  LEDLED_SFH4050_HEAT  [LED_SFH4050_HEAT]
IR178  SFH4050  LEDLED_SFH4050_HEAT  [LED_SFH4050_HEAT]
IR179  SFH4050  LEDLED_SFH4050_HEAT  [LED_SFH4050_HEAT]
IR180  SFH4050  LEDLED_SFH4050_HEAT  [LED_SFH4050_HEAT]
IR181  SFH4050  LEDLED_SFH4050_HEAT  [LED_SFH4050_HEAT]
IR182  SFH4050  LEDLED_SFH4050_HEAT  [LED_SFH4050_HEAT]
IR183  SFH4050  LEDLED_SFH4050_HEAT  [LED_SFH4050_HEAT]
IR184  SFH4050  LEDLED_SFH4050_HEAT  [LED_SFH4050_HEAT]
IR193  SFH4050  LEDLED_SFH4050_HEAT  [LED_SFH4050_HEAT]
IR194  SFH4050  LEDLED_SFH4050_HEAT  [LED_SFH4050_HEAT]
IR195  SFH4050  LEDLED_SFH4050_HEAT  [LED_SFH4050_HEAT]
IR196  SFH4050  LEDLED_SFH4050_HEAT  [LED_SFH4050_HEAT]
IR197  SFH4050  LEDLED_SFH4050_HEAT  [LED_SFH4050_HEAT]
IR198  SFH4050  LEDLED_SFH4050_HEAT  [LED_SFH4050_HEAT]
IR199  SFH4050  LEDLED_SFH4050_HEAT  [LED_SFH4050_HEAT]
IR200  SFH4050  LEDLED_SFH4050_HEAT  [LED_SFH4050_HEAT]
IR209  SFH4050  LEDLED_SFH4050_HEAT  [LED_SFH4050_HEAT]
IR210  SFH4050  LEDLED_SFH4050_HEAT  [LED_SFH4050_HEAT]
IR211  SFH4050  LEDLED_SFH4050_HEAT  [LED_SFH4050_HEAT]
IR212  SFH4050  LEDLED_SFH4050_HEAT  [LED_SFH4050_HEAT]
IR213  SFH4050  LEDLED_SFH4050_HEAT  [LED_SFH4050_HEAT]
IR214  SFH4050  LEDLED_SFH4050_HEAT  [LED_SFH4050_HEAT]
IR215  SFH4050  LEDLED_SFH4050_HEAT  [LED_SFH4050_HEAT]
IR216  SFH4050  LEDLED_SFH4050_HEAT  [LED_SFH4050_HEAT]
IR225  SFH4050  LEDLED_SFH4050_HEAT  [LED_SFH4050_HEAT]
IR226  SFH4050  LEDLED_SFH4050_HEAT  [LED_SFH4050_HEAT]
IR227  SFH4050  LEDLED_SFH4050_HEAT  [LED_SFH4050_HEAT]
IR228  SFH4050  LEDLED_SFH4050_HEAT  [LED_SFH4050_HEAT]
IR229  SFH4050  LEDLED_SFH4050_HEAT  [LED_SFH4050_HEAT]
IR230  SFH4050  LEDLED_SFH4050_HEAT  [LED_SFH4050_HEAT]
IR231  SFH4050  LEDLED_SFH4050_HEAT  [LED_SFH4050_HEAT]
IR232  SFH4050  LEDLED_SFH4050_HEAT  [LED_SFH4050_HEAT]
IR241  SFH4050  LEDLED_SFH4050_HEAT  [LED_SFH4050_HEAT]
IR242  SFH4050  LEDLED_SFH4050_HEAT  [LED_SFH4050_HEAT]
IR243  SFH4050  LEDLED_SFH4050_HEAT  [LED_SFH4050_HEAT]
IR244  SFH4050  LEDLED_SFH4050_HEAT  [LED_SFH4050_HEAT]
IR249  SFH4050  LEDLED_SFH4050_HEAT  [LED_SFH4050_HEAT]
IR250  SFH4050  LEDLED_SFH4050_HEAT  [LED_SFH4050_HEAT]
IR251  SFH4050  LEDLED_SFH4050_HEAT  [LED_SFH4050_HEAT]
IR252  SFH4050  LEDLED_SFH4050  [LED_SFH4050]
L4  68uH/1A  INDUCTOR_SMSRU8043  [SRU8043]
LB33  LED-B  LED-TH  [SUNPLUS-LED]
LB34  LED-B  LED-TH  [SUNPLUS-LED]
LB35  LED-B  LED-TH  [SUNPLUS-LED]
LB36  LED-B  LED-TH  [SUNPLUS-LED]
LB41  LED-B  LED-TH  [SUNPLUS-LED]
LB42  LED-B  LED-TH  [SUNPLUS-LED]
LB43  LED-B  LED-TH  [SUNPLUS-LED]
LB44  LED-B  LED-TH  [SUNPLUS-LED]
LB49  LED-B  LED-TH  [SUNPLUS-LED]
LB50  LED-B  LED-TH  [SUNPLUS-LED]
LB51  LED-B  LED-TH  [SUNPLUS-LED]
LB52  LED-B  LED-TH  [SUNPLUS-LED]
LB57  LED-B  LED-TH  [SUNPLUS-LED]
LB58  LED-B  LED-TH  [SUNPLUS-LED]
LB59  LED-B  LED-TH  [SUNPLUS-LED]
LB60  LED-B  LED-TH  [SUNPLUS-LED]
LG33  LED-G  LED-TH  [SUNPLUS-LED]
LG34  LED-G  LED-TH  [SUNPLUS-LED]
LG35  LED-G  LED-TH  [SUNPLUS-LED]
LG36  LED-G  LED-TH  [SUNPLUS-LED]
LG41  LED-G  LED-TH  [SUNPLUS-LED]
LG42  LED-G  LED-TH  [SUNPLUS-LED]
LG43  LED-G  LED-TH  [SUNPLUS-LED]
LG44  LED-G  LED-TH  [SUNPLUS-LED]
LG49  LED-G  LED-TH  [SUNPLUS-LED]
LG50  LED-G  LED-TH  [SUNPLUS-LED]
LG51  LED-G  LED-TH  [SUNPLUS-LED]
LG52  LED-G  LED-TH  [SUNPLUS-LED]
LG57  LED-G  LED-TH  [SUNPLUS-LED]
LG58  LED-G  LED-TH  [SUNPLUS-LED]
LG59  LED-G  LED-TH  [SUNPLUS-LED]
LG60  LED-G  LED-TH  [SUNPLUS-LED]
LR33  LED-R  LED-TH  [SUNPLUS-LED]
LR34  LED-R  LED-TH  [SUNPLUS-LED]
LR35  LED-R  LED-TH  [SUNPLUS-LED]
LR36  LED-R  LED-TH  [SUNPLUS-LED]
LR41  LED-R  LED-TH  [SUNPLUS-LED]
LR42  LED-R  LED-TH  [SUNPLUS-LED]
LR43  LED-R  LED-TH  [SUNPLUS-LED]
LR44  LED-R  LED-TH  [SUNPLUS-LED]
LR49  LED-R  LED-TH  [SUNPLUS-LED]
LR50  LED-R  LED-TH  [SUNPLUS-LED]
LR51  LED-R  LED-TH  [SUNPLUS-LED]
LR52  LED-R  LED-TH  [SUNPLUS-LED]
LR57  LED-R  LED-TH  [SUNPLUS-LED]
LR58  LED-R  LED-TH  [SUNPLUS-LED]
LR59  LED-R  LED-TH  [SUNPLUS-LED]
LR60  LED-R  LED-TH  [SUNPLUS-LED]
Q10  NPN_DUALLFPAK56_BIGHS  [LFPAK56_HS2]
Q11  NPN_DUALLFPAK56_BIGHS  [LFPAK56_HS2]
Q12  NPN_DUALLFPAK56_BIGHS  [LFPAK56_HS2]
R50  4R99  RESISTOR-POWER1812  [1812]
R51  4R99  RESISTOR-POWER1812  [1812]
R54  49K9  RESISTOR_SM1206S  [1206S]
R55  4R99  RESISTOR-POWER1812  [1812]
R56  4R99  RESISTOR-POWER1812  [1812]
R57  10R0  RESISTOR_SM1206S  [1206S]
R58  49K9  RESISTOR_SM1206S  [1206S]
R59  10R0  RESISTOR_SM1206S  [1206S]
R62  10R0  RESISTOR_SM1206S  [1206S]
R63  10R0  RESISTOR_SM1206S  [1206S]
R64  4R99  RESISTOR-POWER1812  [1812]
R65  4R99  RESISTOR-POWER1812  [1812]
R66  4R99  RESISTOR_SM0805S  [0805S]
R67  49K9  RESISTOR_SM1206S  [1206S]
R68  4.99K  RESISTOR_SM0805S  [0805S]
R69  1R00  RESISTOR_SM1206S  [1206S]
U19  OPA237  AD8065RT  [SOT23-5]
U20  AD5624R-3  AD56X4R  [MSOP10]
U21  OPA237  AD8065RT  [SOT23-5]
U23  OPA237  AD8065RT  [SOT23-5]
U24  AP8802  [SOIC8-EP]
V33  SUNPLUS-VIAS-ONLY  [SUNPLUS-VIAS-ONLY]
V34  SUNPLUS-VIAS-ONLY  [SUNPLUS-VIAS-ONLY]
V35  SUNPLUS-VIAS-ONLY  [SUNPLUS-VIAS-ONLY]
V36  SUNPLUS-VIAS-ONLYTOPVIAS  [SUNPLUS-TOP-VIAS-ONLY]
V41  SUNPLUS-VIAS-ONLY  [SUNPLUS-VIAS-ONLY]
V42  SUNPLUS-VIAS-ONLY  [SUNPLUS-VIAS-ONLY]
V43  SUNPLUS-VIAS-ONLY  [SUNPLUS-VIAS-ONLY]
V44  SUNPLUS-VIAS-ONLYTOPVIAS  [SUNPLUS-TOP-VIAS-ONLY]
V49  SUNPLUS-VIAS-ONLY  [SUNPLUS-VIAS-ONLY]
V50  SUNPLUS-VIAS-ONLY  [SUNPLUS-VIAS-ONLY]
V51  SUNPLUS-VIAS-ONLY  [SUNPLUS-VIAS-ONLY]
V52  SUNPLUS-VIAS-ONLYTOPVIAS  [SUNPLUS-TOP-VIAS-ONLY]
V57  SUNPLUS-VIAS-ONLY  [SUNPLUS-VIAS-ONLY]
V58  SUNPLUS-VIAS-ONLY  [SUNPLUS-VIAS-ONLY]
V59  SUNPLUS-VIAS-ONLY  [SUNPLUS-VIAS-ONLY]
V60  SUNPLUS-VIAS-ONLYTOPVIAS  [SUNPLUS-TOP-VIAS-ONLY]

### Nets
3V3LL: C44.1 C45.1 C46.1 C49.1 C52.1 R66.2 U19.5(+VS) U20.9(VDD) U21.5(+VS) U23.5(+VS)
+3V3A: R66.1 ; also sheet 1,3,4
BLLA: LB49.GC(K) Q10.5(C2) Q10.5A1(C2) Q10.5A(C2) Q10.5B(C2) Q10.5C1(C2) Q10.5C2(C2) Q10.5C(C2) Q10.6(C2) Q10.56(C2) Q10.56A(C2) Q10.56B(C2)
BLLB: LB33.GC(K) Q10.7(C1) Q10.8(C1) Q10.8A(C1) Q10.8B(C1) Q10.8C1(C1) Q10.8C2(C1) Q10.8C3(C1) Q10.8C(C1) Q10.78(C1) Q10.78A(C1) Q10.78B(C1)
BLU_LL: U19.3(IN+) U20.1(VO_A)
GLLA: LG49.GC(K) Q12.5(C2) Q12.5A1(C2) Q12.5A(C2) Q12.5B(C2) Q12.5C1(C2) Q12.5C2(C2) Q12.5C(C2) Q12.6(C2) Q12.56(C2) Q12.56A(C2) Q12.56B(C2)
GLLB: LG33.GC(K) Q12.7(C1) Q12.8(C1) Q12.8A(C1) Q12.8B(C1) Q12.8C1(C1) Q12.8C2(C1) Q12.8C3(C1) Q12.8C(C1) Q12.78(C1) Q12.78A(C1) Q12.78B(C1)
GRN_LL: U20.2(VO_B) U23.3(IN+)
IGND: C54.2 R68.1 U24.2(GND) U24.7(GND1) U24.EP ; also sheet 1,3,4
IR_DRV_LL: C55.1 IR145.A IR145.A1(A) IR177.A IR177.A1(A) IR209.A IR209.A1(A) IR241.A IR241.A1(A) R69.1 U24.1(SET)
IR_LL: R68.2 U20.5(VO_D) U24.8(CTRL)
IR_RET_UL1: C55.2 L4.1 R57.2 R59.2 R62.2 R63.2
LGND: C42.2 C44.2 C45.2 C46.2 C47.2 C48.2 C49.2 C50.2 C52.2 R50.1 R51.1 R55.1 R56.1 R64.1 R65.1 U19.2(-VS) U20.3(GND) U21.2(-VS) U23.2(-VS) ; also sheet 1,3,4
LL_EN: U20.6(!SYNC) ; also sheet 1
MOSI: U20.8(DIN) ; also sheet 1,3,4
N$59: IR135.A IR135.A1(A) IR136.C(K)
N$62: IR134.A IR134.A1(A) IR135.C1(K) IR135.C(K)
N$76: IR133.A IR133.A1(A) IR134.C1(K) IR134.C(K)
N$90: C47.1 U20.10(REFIO)
N$122: IR131.A IR131.A1(A) IR132.C1(K) IR132.C(K)
N$127: IR130.A IR130.A1(A) IR131.C1(K) IR131.C(K)
N$128: IR129.A IR129.A1(A) IR130.C1(K) IR130.C(K)
N$130: IR145.C1(K) IR145.C(K) IR146.A IR146.A1(A)
N$132: IR146.C1(K) IR146.C(K) IR147.A IR147.A1(A)
N$133: IR147.C1(K) IR147.C(K) IR148.A IR148.A1(A)
N$134: IR132.A IR132.A1(A) IR133.C1(K) IR133.C(K)
N$135: IR167.A IR167.A1(A) IR168.C1(K) IR168.C(K)
N$136: IR166.A IR166.A1(A) IR167.C1(K) IR167.C(K)
N$137: IR165.A IR165.A1(A) IR166.C1(K) IR166.C(K)
N$138: IR164.A IR164.A1(A) IR165.C1(K) IR165.C(K)
N$139: IR163.A IR163.A1(A) IR164.C1(K) IR164.C(K)
N$140: IR162.A IR162.A1(A) IR163.C1(K) IR163.C(K)
N$141: IR161.A IR161.A1(A) IR162.C1(K) IR162.C(K)
N$142: IR149.C1(K) IR149.C(K) IR150.A IR150.A1(A)
N$143: IR150.C1(K) IR150.C(K) IR151.A IR151.A1(A)
N$144: IR151.C1(K) IR151.C(K) IR152.A IR152.A1(A)
N$145: IR177.C1(K) IR177.C(K) IR178.A IR178.A1(A)
N$146: IR178.C1(K) IR178.C(K) IR179.A IR179.A1(A)
N$147: IR179.C1(K) IR179.C(K) IR180.A IR180.A1(A)
N$148: IR181.C1(K) IR181.C(K) IR182.A IR182.A1(A)
N$149: IR182.C1(K) IR182.C(K) IR183.A IR183.A1(A)
N$150: IR183.C1(K) IR183.C(K) IR184.A IR184.A1(A)
N$151: IR148.C1(K) IR148.C(K) IR149.A IR149.A1(A)
N$152: IR136.A IR152.C1(K) IR152.C(K)
N$153: IR180.C1(K) IR180.C(K) IR181.A IR181.A1(A)
N$154: IR168.A IR168.A1(A) IR184.C1(K) IR184.C(K)
N$155: IR129.C(K) R57.1
N$156: IR161.C1(K) IR161.C(K) R59.1
N$157: IR199.A IR199.A1(A) IR200.C1(K) IR200.C(K)
N$158: IR198.A IR198.A1(A) IR199.C1(K) IR199.C(K)
N$159: IR197.A IR197.A1(A) IR198.C1(K) IR198.C(K)
N$160: IR195.A IR195.A1(A) IR196.C1(K) IR196.C(K)
N$161: IR194.A IR194.A1(A) IR195.C1(K) IR195.C(K)
N$162: IR193.A IR193.A1(A) IR194.C1(K) IR194.C(K)
N$163: IR209.C1(K) IR209.C(K) IR210.A IR210.A1(A)
N$164: IR210.C1(K) IR210.C(K) IR211.A IR211.A1(A)
N$165: IR211.C1(K) IR211.C(K) IR212.A IR212.A1(A)
N$166: IR196.A IR196.A1(A) IR197.C1(K) IR197.C(K)
N$167: IR231.A IR231.A1(A) IR232.C1(K) IR232.C(K)
N$168: IR230.A IR230.A1(A) IR231.C1(K) IR231.C(K)
N$169: IR229.A IR229.A1(A) IR230.C1(K) IR230.C(K)
N$170: IR228.A IR228.A1(A) IR229.C1(K) IR229.C(K)
N$171: IR227.A IR227.A1(A) IR228.C1(K) IR228.C(K)
N$172: IR226.A IR226.A1(A) IR227.C1(K) IR227.C(K)
N$173: IR225.A IR225.A1(A) IR226.C1(K) IR226.C(K)
N$174: IR213.C1(K) IR213.C(K) IR214.A IR214.A1(A)
N$175: IR214.C1(K) IR214.C(K) IR215.A IR215.A1(A)
N$176: IR215.C1(K) IR215.C(K) IR216.A IR216.A1(A)
N$177: IR241.C1(K) IR241.C(K) IR242.A IR242.A1(A)
N$178: IR242.C1(K) IR242.C(K) IR243.A IR243.A1(A)
N$179: IR243.C1(K) IR243.C(K) IR249.A IR249.A1(A)
N$180: IR244.C1(K) IR244.C(K) IR250.A IR250.A1(A)
N$181: IR250.C1(K) IR250.C(K) IR251.A IR251.A1(A)
N$182: IR251.C1(K) IR251.C(K) IR252.A
N$183: IR212.C1(K) IR212.C(K) IR213.A IR213.A1(A)
N$184: IR200.A IR200.A1(A) IR216.C1(K) IR216.C(K)
N$185: IR244.A IR244.A1(A) IR249.C1(K) IR249.C(K)
N$186: IR232.A IR232.A1(A) IR252.C(K)
N$187: IR193.C1(K) IR193.C(K) R62.1
N$188: IR225.C1(K) IR225.C(K) R63.1
N$189: Q10.3(E2) R51.2 R54.1 U19.4(IN-)
N$190: D5.A L4.2 U24.5(SW) U24.6(SW1)
N$191: Q11.3(E2) R56.2 R58.1 U21.4(IN-)
N$193: Q11.2(B1) Q11.4(B2) U21.1(OUT)
N$194: LG41.GC(K) LG42.GA(A)
N$195: LR41.GC(K) LR42.GA(A)
N$196: LB41.GC(K) LB42.GA(A)
N$197: LG42.GC(K) LG43.GA(A)
N$198: LR42.GC(K) LR43.GA(A)
N$199: LB42.GC(K) LB43.GA(A)
N$200: LG43.GC(K) LG44.GA(A)
N$202: LR43.GC(K) LR44.GA(A)
N$204: LB43.GC(K) LB44.GA(A)
N$205: LG36.GA(A) LG44.GC(K)
N$206: LR36.GA(A) LR44.GC(K)
N$207: LG57.GC(K) LG58.GA(A)
N$209: LR57.GC(K) LR58.GA(A)
N$210: LB57.GC(K) LB58.GA(A)
N$211: LG58.GC(K) LG59.GA(A)
N$212: LR58.GC(K) LR59.GA(A)
N$213: LB58.GC(K) LB59.GA(A)
N$214: LG59.GC(K) LG60.GA(A)
N$215: LR59.GC(K) LR60.GA(A)
N$216: LB59.GC(K) LB60.GA(A)
N$217: LG52.GA(A) LG60.GC(K)
N$219: Q12.3(E2) R65.2 R67.1 U23.4(IN-)
N$220: Q12.2(B1) Q12.4(B2) U23.1(OUT)
N$222: LR52.GA(A) LR60.GC(K)
N$223: LB52.GA(A) LB60.GC(K)
N$224: LB36.GA(A) LB44.GC(K)
N$225: LB33.GA(A) LB34.GC(K)
N$226: LR33.GA(A) LR34.GC(K)
N$227: LG33.GA(A) LG34.GC(K)
N$228: LB34.GA(A) LB35.GC(K)
N$229: LR34.GA(A) LR35.GC(K)
N$230: LG34.GA(A) LG35.GC(K)
N$231: LG35.GA(A) LG36.GC(K)
N$232: LR35.GA(A) LR36.GC(K)
N$233: LB35.GA(A) LB36.GC(K)
N$234: LG51.GA(A) LG52.GC(K)
N$235: LR51.GA(A) LR52.GC(K)
N$236: LB51.GA(A) LB52.GC(K)
N$237: LG50.GA(A) LG51.GC(K)
N$238: LR50.GA(A) LR51.GC(K)
N$239: LB50.GA(A) LB51.GC(K)
N$240: LG49.GA(A) LG50.GC(K)
N$241: LR49.GA(A) LR50.GC(K)
N$242: LB49.GA(A) LB50.GC(K)
N$243: Q10.2(B1) Q10.4(B2) U19.1(OUT)
N$245: Q10.1(E1) R50.2
N$246: Q11.1(E1) R55.2
N$249: Q12.1(E1) R64.2
N$499: LB41.T(TH) LG41.T(TH) LR41.T(TH) V41.T1(TH) V41.T2(TH) V41.T3(TH) V41.T4(TH) V41.T5(TH) V41.T6(TH)
N$515: LB42.T(TH) LG42.T(TH) LR42.T(TH) V42.T1(TH) V42.T2(TH) V42.T3(TH) V42.T4(TH) V42.T5(TH) V42.T6(TH)
N$516: LB43.T(TH) LG43.T(TH) LR43.T(TH) V43.T1(TH) V43.T2(TH) V43.T3(TH) V43.T4(TH) V43.T5(TH) V43.T6(TH)
N$517: LB33.T(TH) LG33.T(TH) LR33.T(TH) V33.T1(TH) V33.T2(TH) V33.T3(TH) V33.T4(TH) V33.T5(TH) V33.T6(TH)
N$518: LB36.T(TH) LG36.T(TH) LR36.T(TH) V36.T1(TH) V36.T2(TH) V36.T3(TH)
N$519: LB57.T(TH) LG57.T(TH) LR57.T(TH) V57.T1(TH) V57.T2(TH) V57.T3(TH) V57.T4(TH) V57.T5(TH) V57.T6(TH)
N$520: LB58.T(TH) LG58.T(TH) LR58.T(TH) V58.T1(TH) V58.T2(TH) V58.T3(TH) V58.T4(TH) V58.T5(TH) V58.T6(TH)
N$521: LB59.T(TH) LG59.T(TH) LR59.T(TH) V59.T1(TH) V59.T2(TH) V59.T3(TH) V59.T4(TH) V59.T5(TH) V59.T6(TH)
N$522: LB52.T(TH) LG52.T(TH) LR52.T(TH) V52.T1(TH) V52.T2(TH) V52.T3(TH)
N$523: LB51.T(TH) LG51.T(TH) LR51.T(TH) V51.T1(TH) V51.T2(TH) V51.T3(TH) V51.T4(TH) V51.T5(TH) V51.T6(TH)
N$524: LB49.T(TH) LG49.T(TH) LR49.T(TH) V49.T1(TH) V49.T2(TH) V49.T3(TH) V49.T4(TH) V49.T5(TH) V49.T6(TH)
N$525: LB34.T(TH) LG34.T(TH) LR34.T(TH) V34.T1(TH) V34.T2(TH) V34.T3(TH) V34.T4(TH) V34.T5(TH) V34.T6(TH)
RED_LL: U20.4(VO_C) U21.3(IN+)
RLLA: LR49.GC(K) Q11.5(C2) Q11.5A1(C2) Q11.5A(C2) Q11.5B(C2) Q11.5C1(C2) Q11.5C2(C2) Q11.5C(C2) Q11.6(C2) Q11.56(C2) Q11.56A(C2) Q11.56B(C2)
RLLB: LR33.GC(K) Q11.7(C1) Q11.8(C1) Q11.8A(C1) Q11.8B(C1) Q11.8C1(C1) Q11.8C2(C1) Q11.8C3(C1) Q11.8C(C1) Q11.78(C1) Q11.78A(C1) Q11.78B(C1)
SCLK: U20.7(SCLK) ; also sheet 1,3,4
TH5: LB35.T(TH) LG35.T(TH) LR35.T(TH) V35.T1(TH) V35.T2(TH) V35.T3(TH) V35.T4(TH) V35.T5(TH) V35.T6(TH)
TH6: LB60.T(TH) LG60.T(TH) LR60.T(TH) V60.T1(TH) V60.T2(TH) V60.T3(TH)
TH10: LB50.T(TH) LG50.T(TH) LR50.T(TH) V50.T1(TH) V50.T2(TH) V50.T3(TH) V50.T4(TH) V50.T5(TH) V50.T6(TH)
TH13: LB44.T(TH) LG44.T(TH) LR44.T(TH) V44.T1(TH) V44.T2(TH) V44.T3(TH)
V_IR: C54.1 D5.K R69.2 U24.4(VIN) ; also sheet 1,3,4
V_RGB: C42.1 C48.1 C50.1 LB41.GA(A) LB57.GA(A) LG41.GA(A) LG57.GA(A) LR41.GA(A) LR57.GA(A) R54.2 R58.2 R67.2 ; also sheet 1,3,4
Unconnected: U24.3(N/C)

### Notes on the sheet
- LL

## Sheet 3 of 4
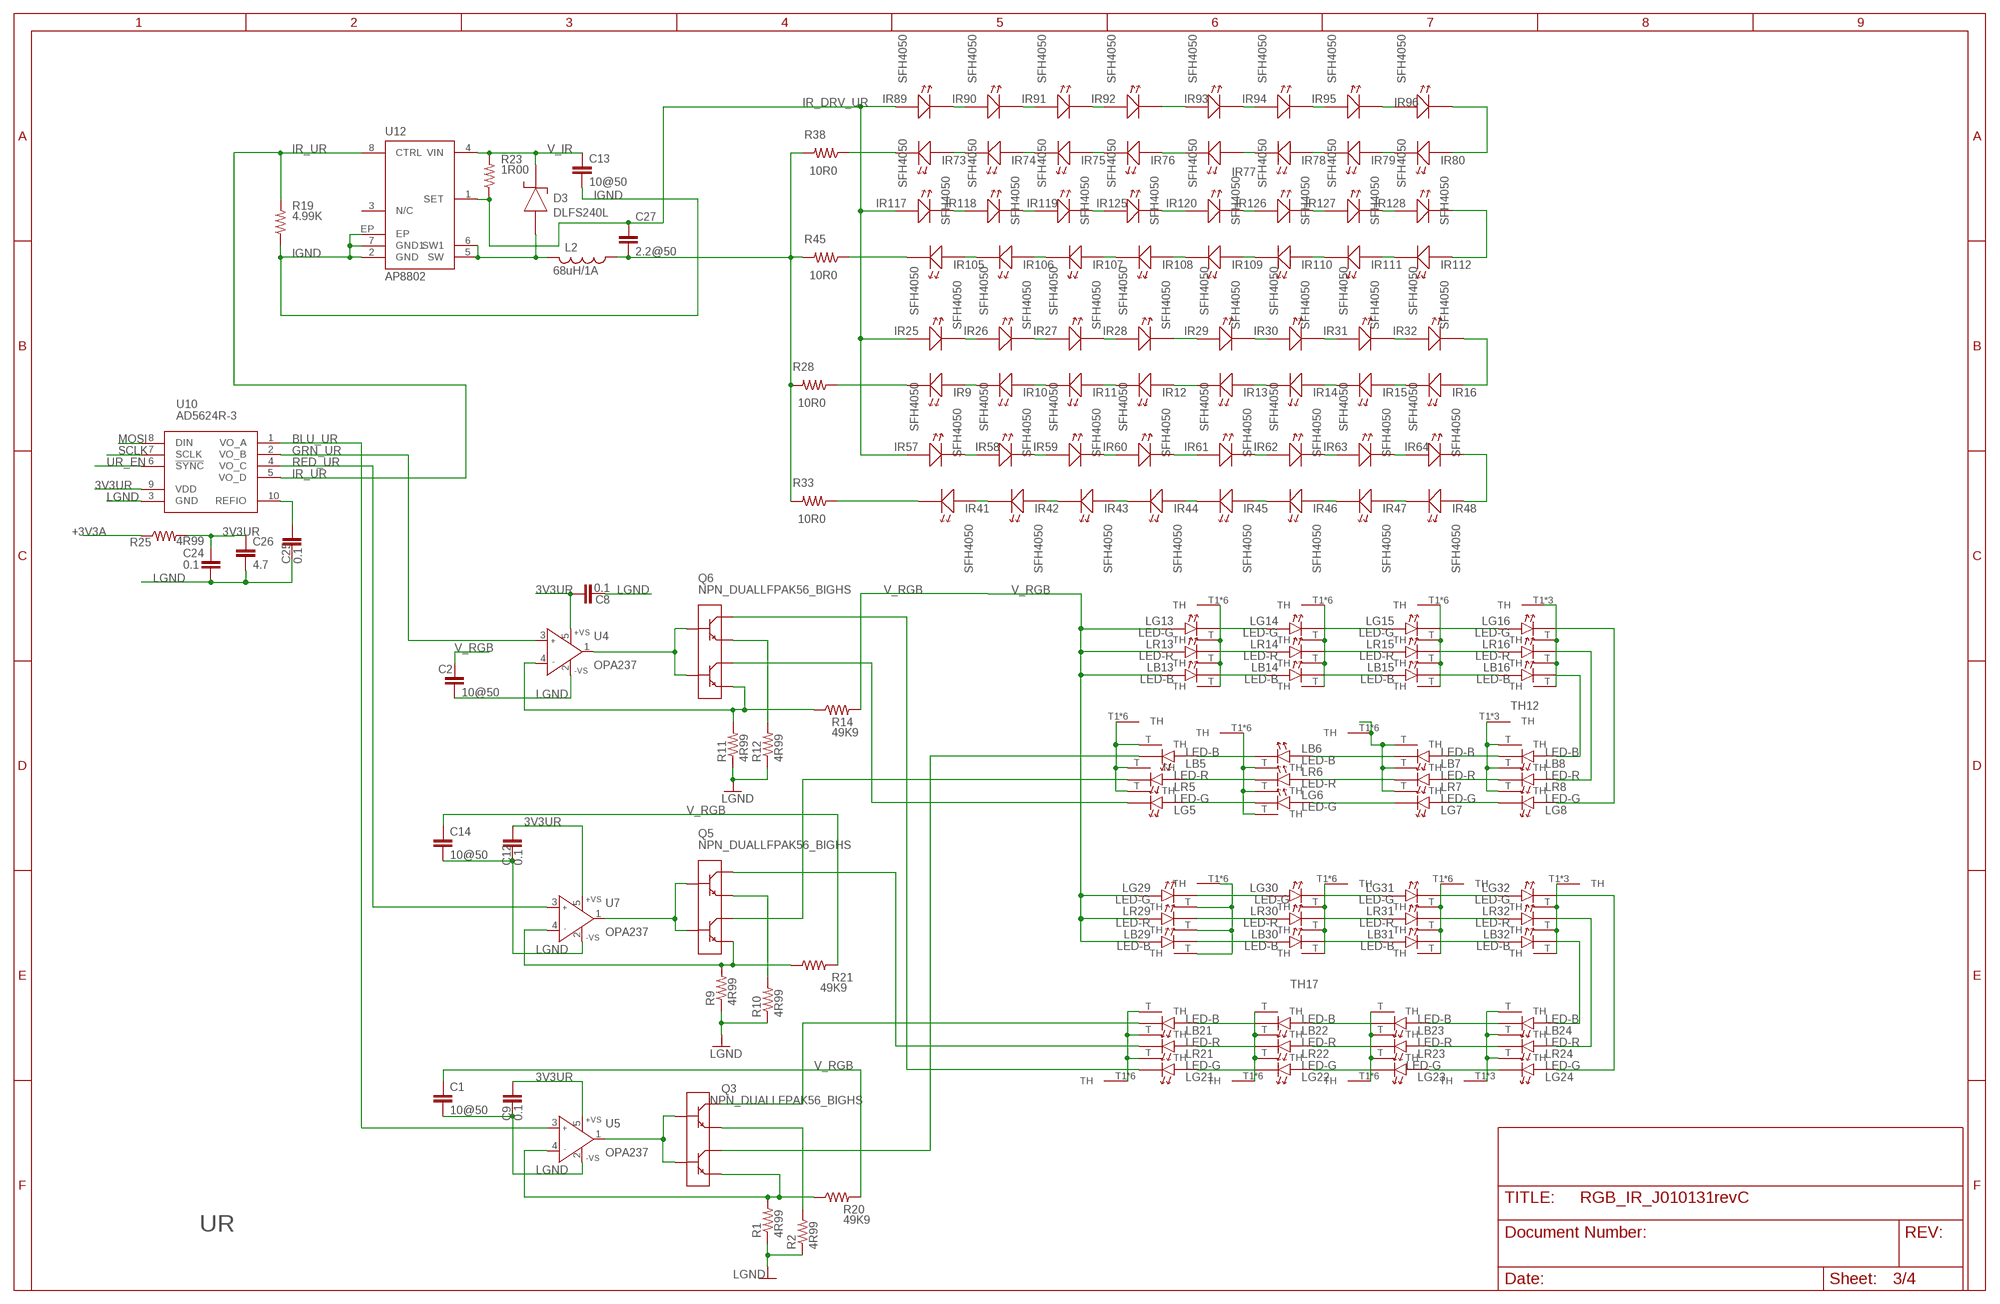
[diagram p2: schematic, sheet 3]

### Parts
C1  10@50  CAPS1210S  [1210S]
C2  10@50  CAPS1210S  [1210S]
C8  0.1  CAPS0603S  [0603S]
C9  0.1  CAPS0603S  [0603S]
C12  0.1  CAPS0603S  [0603S]
C13  10@50  CAPS1210S  [1210S]
C14  10@50  CAPS1210S  [1210S]
C24  0.1  CAPS0603S  [0603S]
C25  0.1  CAPS0603S  [0603S]
C26  4.7  CAPS0805S  [0805S]
C27  2.2@50  CAPS1206S  [1206S]
D3  DLFS240L  DIODE_SCHOTTKYPWRDI-123  [PWRDI-123]
IR9  SFH4050  LEDLED_SFH4050_HEAT  [LED_SFH4050_HEAT]
IR10  SFH4050  LEDLED_SFH4050_HEAT  [LED_SFH4050_HEAT]
IR11  SFH4050  LEDLED_SFH4050_HEAT  [LED_SFH4050_HEAT]
IR12  SFH4050  LEDLED_SFH4050_HEAT  [LED_SFH4050_HEAT]
IR13  SFH4050  LEDLED_SFH4050_HEAT  [LED_SFH4050_HEAT]
IR14  SFH4050  LEDLED_SFH4050_HEAT  [LED_SFH4050_HEAT]
IR15  SFH4050  LEDLED_SFH4050_HEAT  [LED_SFH4050_HEAT]
IR16  SFH4050  LEDLED_SFH4050_HEAT  [LED_SFH4050_HEAT]
IR25  SFH4050  LEDLED_SFH4050_HEAT  [LED_SFH4050_HEAT]
IR26  SFH4050  LEDLED_SFH4050_HEAT  [LED_SFH4050_HEAT]
IR27  SFH4050  LEDLED_SFH4050_HEAT  [LED_SFH4050_HEAT]
IR28  SFH4050  LEDLED_SFH4050_HEAT  [LED_SFH4050_HEAT]
IR29  SFH4050  LEDLED_SFH4050_HEAT  [LED_SFH4050_HEAT]
IR30  SFH4050  LEDLED_SFH4050_HEAT  [LED_SFH4050_HEAT]
IR31  SFH4050  LEDLED_SFH4050_HEAT  [LED_SFH4050_HEAT]
IR32  SFH4050  LEDLED_SFH4050_HEAT  [LED_SFH4050_HEAT]
IR41  SFH4050  LEDLED_SFH4050_HEAT  [LED_SFH4050_HEAT]
IR42  SFH4050  LEDLED_SFH4050_HEAT  [LED_SFH4050_HEAT]
IR43  SFH4050  LEDLED_SFH4050_HEAT  [LED_SFH4050_HEAT]
IR44  SFH4050  LEDLED_SFH4050_HEAT  [LED_SFH4050_HEAT]
IR45  SFH4050  LEDLED_SFH4050_HEAT  [LED_SFH4050_HEAT]
IR46  SFH4050  LEDLED_SFH4050_HEAT  [LED_SFH4050_HEAT]
IR47  SFH4050  LEDLED_SFH4050_HEAT  [LED_SFH4050_HEAT]
IR48  SFH4050  LEDLED_SFH4050_HEAT  [LED_SFH4050_HEAT]
IR57  SFH4050  LEDLED_SFH4050_HEAT  [LED_SFH4050_HEAT]
IR58  SFH4050  LEDLED_SFH4050_HEAT  [LED_SFH4050_HEAT]
IR59  SFH4050  LEDLED_SFH4050_HEAT  [LED_SFH4050_HEAT]
IR60  SFH4050  LEDLED_SFH4050_HEAT  [LED_SFH4050_HEAT]
IR61  SFH4050  LEDLED_SFH4050_HEAT  [LED_SFH4050_HEAT]
IR62  SFH4050  LEDLED_SFH4050_HEAT  [LED_SFH4050_HEAT]
IR63  SFH4050  LEDLED_SFH4050_HEAT  [LED_SFH4050_HEAT]
IR64  SFH4050  LEDLED_SFH4050_HEAT  [LED_SFH4050_HEAT]
IR73  SFH4050  LEDLED_SFH4050_HEAT  [LED_SFH4050_HEAT]
IR74  SFH4050  LEDLED_SFH4050_HEAT  [LED_SFH4050_HEAT]
IR75  SFH4050  LEDLED_SFH4050_HEAT  [LED_SFH4050_HEAT]
IR76  SFH4050  LEDLED_SFH4050_HEAT  [LED_SFH4050_HEAT]
IR77  SFH4050  LEDLED_SFH4050_HEAT  [LED_SFH4050_HEAT]
IR78  SFH4050  LEDLED_SFH4050_HEAT  [LED_SFH4050_HEAT]
IR79  SFH4050  LEDLED_SFH4050_HEAT  [LED_SFH4050_HEAT]
IR80  SFH4050  LEDLED_SFH4050_HEAT  [LED_SFH4050_HEAT]
IR89  SFH4050  LEDLED_SFH4050_HEAT  [LED_SFH4050_HEAT]
IR90  SFH4050  LEDLED_SFH4050_HEAT  [LED_SFH4050_HEAT]
IR91  SFH4050  LEDLED_SFH4050_HEAT  [LED_SFH4050_HEAT]
IR92  SFH4050  LEDLED_SFH4050_HEAT  [LED_SFH4050_HEAT]
IR93  SFH4050  LEDLED_SFH4050_HEAT  [LED_SFH4050_HEAT]
IR94  SFH4050  LEDLED_SFH4050_HEAT  [LED_SFH4050_HEAT]
IR95  SFH4050  LEDLED_SFH4050_HEAT  [LED_SFH4050_HEAT]
IR96  SFH4050  LEDLED_SFH4050_HEAT  [LED_SFH4050_HEAT]
IR105  SFH4050  LEDLED_SFH4050_HEAT  [LED_SFH4050_HEAT]
IR106  SFH4050  LEDLED_SFH4050_C  [LED_SFH4050_HEAT_C]
IR107  SFH4050  LEDLED_SFH4050_HEAT  [LED_SFH4050_HEAT]
IR108  SFH4050  LEDLED_SFH4050_HEAT  [LED_SFH4050_HEAT]
IR109  SFH4050  LEDLED_SFH4050_HEAT  [LED_SFH4050_HEAT]
IR110  SFH4050  LEDLED_SFH4050_HEAT  [LED_SFH4050_HEAT]
IR111  SFH4050  LEDLED_SFH4050_HEAT  [LED_SFH4050_HEAT]
IR112  SFH4050  LEDLED_SFH4050_HEAT  [LED_SFH4050_HEAT]
IR117  SFH4050  LEDLED_SFH4050  [LED_SFH4050]
IR118  SFH4050  LEDLED_SFH4050_HEAT  [LED_SFH4050_HEAT]
IR119  SFH4050  LEDLED_SFH4050_HEAT  [LED_SFH4050_HEAT]
IR120  SFH4050  LEDLED_SFH4050_HEAT  [LED_SFH4050_HEAT]
IR125  SFH4050  LEDLED_SFH4050_HEAT  [LED_SFH4050_HEAT]
IR126  SFH4050  LEDLED_SFH4050_HEAT  [LED_SFH4050_HEAT]
IR127  SFH4050  LEDLED_SFH4050_HEAT  [LED_SFH4050_HEAT]
IR128  SFH4050  LEDLED_SFH4050  [LED_SFH4050]
L2  68uH/1A  INDUCTOR_SMSRU8043  [SRU8043]
LB5  LED-B  LED-TH  [SUNPLUS-LED]
LB6  LED-B  LED-TH  [SUNPLUS-LED]
LB7  LED-B  LED-TH  [SUNPLUS-LED]
LB8  LED-B  LED-TH  [SUNPLUS-LED]
LB13  LED-B  LED-TH  [SUNPLUS-LED]
LB14  LED-B  LED-TH  [SUNPLUS-LED]
LB15  LED-B  LED-TH  [SUNPLUS-LED]
LB16  LED-B  LED-TH  [SUNPLUS-LED]
LB21  LED-B  LED-TH  [SUNPLUS-LED]
LB22  LED-B  LED-TH  [SUNPLUS-LED]
LB23  LED-B  LED-TH  [SUNPLUS-LED]
LB24  LED-B  LED-TH  [SUNPLUS-LED]
LB29  LED-B  LED-TH  [SUNPLUS-LED]
LB30  LED-B  LED-TH  [SUNPLUS-LED]
LB31  LED-B  LED-TH  [SUNPLUS-LED]
LB32  LED-B  LED-TH  [SUNPLUS-LED]
LG5  LED-G  LED-TH  [SUNPLUS-LED]
LG6  LED-G  LED-TH  [SUNPLUS-LED]
LG7  LED-G  LED-TH  [SUNPLUS-LED]
LG8  LED-G  LED-TH  [SUNPLUS-LED]
LG13  LED-G  LED-TH  [SUNPLUS-LED]
LG14  LED-G  LED-TH  [SUNPLUS-LED]
LG15  LED-G  LED-TH  [SUNPLUS-LED]
LG16  LED-G  LED-TH  [SUNPLUS-LED]
LG21  LED-G  LED-TH  [SUNPLUS-LED]
LG22  LED-G  LED-TH  [SUNPLUS-LED]
LG23  LED-G  LED-TH  [SUNPLUS-LED]
LG24  LED-G  LED-TH  [SUNPLUS-LED]
LG29  LED-G  LED-TH  [SUNPLUS-LED]
LG30  LED-G  LED-TH  [SUNPLUS-LED]
LG31  LED-G  LED-TH  [SUNPLUS-LED]
LG32  LED-G  LED-TH  [SUNPLUS-LED]
LR5  LED-R  LED-TH  [SUNPLUS-LED]
LR6  LED-R  LED-TH  [SUNPLUS-LED]
LR7  LED-R  LED-TH  [SUNPLUS-LED]
LR8  LED-R  LED-TH  [SUNPLUS-LED]
LR13  LED-R  LED-TH  [SUNPLUS-LED]
LR14  LED-R  LED-TH  [SUNPLUS-LED]
LR15  LED-R  LED-TH  [SUNPLUS-LED]
LR16  LED-R  LED-TH  [SUNPLUS-LED]
LR21  LED-R  LED-TH  [SUNPLUS-LED]
LR22  LED-R  LED-TH  [SUNPLUS-LED]
LR23  LED-R  LED-TH  [SUNPLUS-LED]
LR24  LED-R  LED-TH  [SUNPLUS-LED]
LR29  LED-R  LED-TH  [SUNPLUS-LED]
LR30  LED-R  LED-TH  [SUNPLUS-LED]
LR31  LED-R  LED-TH  [SUNPLUS-LED]
LR32  LED-R  LED-TH  [SUNPLUS-LED]
Q3  NPN_DUALLFPAK56_BIGHS  [LFPAK56_HS2]
Q5  NPN_DUALLFPAK56_BIGHS  [LFPAK56_HS2]
Q6  NPN_DUALLFPAK56_BIGHS  [LFPAK56_HS2]
R1  4R99  RESISTOR-POWER1812  [1812]
R2  4R99  RESISTOR-POWER1812  [1812]
R9  4R99  RESISTOR-POWER1812  [1812]
R10  4R99  RESISTOR-POWER1812  [1812]
R11  4R99  RESISTOR-POWER1812  [1812]
R12  4R99  RESISTOR-POWER1812  [1812]
R14  49K9  RESISTOR_SM1206S  [1206S]
R19  4.99K  RESISTOR_SM0805S  [0805S]
R20  49K9  RESISTOR_SM1206S  [1206S]
R21  49K9  RESISTOR_SM1206S  [1206S]
R23  1R00  RESISTOR_SM1206S  [1206S]
R25  4R99  RESISTOR_SM0805S  [0805S]
R28  10R0  RESISTOR_SM1206S  [1206S]
R33  10R0  RESISTOR_SM1206S  [1206S]
R38  10R0  RESISTOR_SM1206S  [1206S]
R45  10R0  RESISTOR_SM1206S  [1206S]
U4  OPA237  AD8065RT  [SOT23-5]
U5  OPA237  AD8065RT  [SOT23-5]
U7  OPA237  AD8065RT  [SOT23-5]
U10  AD5624R-3  AD56X4R  [MSOP10]
U12  AP8802  [SOIC8-EP]
V5  SUNPLUS-VIAS-ONLY  [SUNPLUS-VIAS-ONLY]
V6  SUNPLUS-VIAS-ONLY  [SUNPLUS-VIAS-ONLY]
V7  SUNPLUS-VIAS-ONLY  [SUNPLUS-VIAS-ONLY]
V8  SUNPLUS-VIAS-ONLYTOPVIAS  [SUNPLUS-TOP-VIAS-ONLY]
V13  SUNPLUS-VIAS-ONLY  [SUNPLUS-VIAS-ONLY]
V14  SUNPLUS-VIAS-ONLY  [SUNPLUS-VIAS-ONLY]
V15  SUNPLUS-VIAS-ONLY  [SUNPLUS-VIAS-ONLY]
V16  SUNPLUS-VIAS-ONLYTOPVIAS  [SUNPLUS-TOP-VIAS-ONLY]
V21  SUNPLUS-VIAS-ONLY  [SUNPLUS-VIAS-ONLY]
V22  SUNPLUS-VIAS-ONLY  [SUNPLUS-VIAS-ONLY]
V23  SUNPLUS-VIAS-ONLY  [SUNPLUS-VIAS-ONLY]
V24  SUNPLUS-VIAS-ONLYTOPVIAS  [SUNPLUS-TOP-VIAS-ONLY]
V29  SUNPLUS-VIAS-ONLY  [SUNPLUS-VIAS-ONLY]
V30  SUNPLUS-VIAS-ONLY  [SUNPLUS-VIAS-ONLY]
V31  SUNPLUS-VIAS-ONLY  [SUNPLUS-VIAS-ONLY]
V32  SUNPLUS-VIAS-ONLYTOPVIAS  [SUNPLUS-TOP-VIAS-ONLY]

### Nets
3V3UR: C8.1 C9.1 C12.1 C24.1 C26.1 R25.2 U4.5(+VS) U5.5(+VS) U7.5(+VS) U10.9(VDD)
+3V3A: R25.1 ; also sheet 1,2,4
BLU_UR: U5.3(IN+) U10.1(VO_A)
GRN_UR: U4.3(IN+) U10.2(VO_B)
IGND: C13.2 R19.1 U12.2(GND) U12.7(GND1) U12.EP ; also sheet 1,2,4
IR_DRV_UR: C27.1 IR25.A IR25.A1(A) IR57.A IR57.A1(A) IR89.A IR89.A1(A) IR117.A R23.1 U12.1(SET)
IR_RET_UL2: C27.2 L2.1 R28.2 R33.2 R38.2 R45.2
IR_UR: R19.2 U10.5(VO_D) U12.8(CTRL)
LGND: C1.2 C2.2 C8.2 C9.2 C12.2 C14.2 C24.2 C25.2 C26.2 R1.1 R2.1 R9.1 R10.1 R11.1 R12.1 U4.2(-VS) U5.2(-VS) U7.2(-VS) U10.3(GND) ; also sheet 1,2,4
MOSI: U10.8(DIN) ; also sheet 1,2,4
N$96: C25.1 U10.10(REFIO)
N$247: LG13.GC(K) LG14.GA(A)
N$248: LR13.GC(K) LR14.GA(A)
N$258: IR15.A IR15.A1(A) IR16.C1(K) IR16.C(K)
N$259: IR14.A IR14.A1(A) IR15.C1(K) IR15.C(K)
N$260: IR13.A IR13.A1(A) IR14.C1(K) IR14.C(K)
N$261: IR11.A IR11.A1(A) IR12.C1(K) IR12.C(K)
N$262: IR10.A IR10.A1(A) IR11.C1(K) IR11.C(K)
N$263: IR9.A IR9.A1(A) IR10.C1(K) IR10.C(K)
N$264: IR25.C1(K) IR25.C(K) IR26.A IR26.A1(A)
N$265: IR26.C1(K) IR26.C(K) IR27.A IR27.A1(A)
N$266: IR27.C1(K) IR27.C(K) IR28.A IR28.A1(A)
N$267: IR12.A IR12.A1(A) IR13.C1(K) IR13.C(K)
N$268: IR47.A IR47.A1(A) IR48.C1(K) IR48.C(K)
N$269: IR46.A IR46.A1(A) IR47.C1(K) IR47.C(K)
N$270: IR45.A IR45.A1(A) IR46.C1(K) IR46.C(K)
N$271: IR44.A IR44.A1(A) IR45.C1(K) IR45.C(K)
N$272: IR43.A IR43.A1(A) IR44.C1(K) IR44.C(K)
N$273: IR42.A IR42.A1(A) IR43.C1(K) IR43.C(K)
N$274: IR41.A IR41.A1(A) IR42.C1(K) IR42.C(K)
N$275: IR29.C1(K) IR29.C(K) IR30.A IR30.A1(A)
N$276: IR30.C1(K) IR30.C(K) IR31.A IR31.A1(A)
N$277: IR31.C1(K) IR31.C(K) IR32.A IR32.A1(A)
N$278: IR57.C1(K) IR57.C(K) IR58.A IR58.A1(A)
N$279: IR58.C1(K) IR58.C(K) IR59.A IR59.A1(A)
N$280: IR59.C1(K) IR59.C(K) IR60.A IR60.A1(A)
N$281: IR61.C1(K) IR61.C(K) IR62.A IR62.A1(A)
N$282: IR62.C1(K) IR62.C(K) IR63.A IR63.A1(A)
N$283: IR63.C1(K) IR63.C(K) IR64.A IR64.A1(A)
N$284: IR28.C1(K) IR28.C(K) IR29.A IR29.A1(A)
N$285: IR16.A IR16.A1(A) IR32.C1(K) IR32.C(K)
N$286: IR60.C1(K) IR60.C(K) IR61.A IR61.A1(A)
N$287: IR48.A IR48.A1(A) IR64.C1(K) IR64.C(K)
N$288: IR9.C1(K) IR9.C(K) R28.1
N$289: IR41.C1(K) IR41.C(K) R33.1
N$290: IR79.A IR79.A1(A) IR80.C1(K) IR80.C(K)
N$291: IR78.A IR78.A1(A) IR79.C1(K) IR79.C(K)
N$292: IR77.A IR77.A1(A) IR78.C1(K) IR78.C(K)
N$293: IR75.A IR75.A1(A) IR76.C1(K) IR76.C(K)
N$294: IR74.A IR74.A1(A) IR75.C1(K) IR75.C(K)
N$295: IR73.A IR73.A1(A) IR74.C1(K) IR74.C(K)
N$296: IR89.C1(K) IR89.C(K) IR90.A IR90.A1(A)
N$297: IR90.C1(K) IR90.C(K) IR91.A IR91.A1(A)
N$298: IR91.C1(K) IR91.C(K) IR92.A IR92.A1(A)
N$299: IR76.A IR76.A1(A) IR77.C1(K) IR77.C(K)
N$300: IR111.A IR111.A1(A) IR112.C1(K) IR112.C(K)
N$301: IR110.A IR110.A1(A) IR111.C1(K) IR111.C(K)
N$302: IR109.A IR109.A1(A) IR110.C1(K) IR110.C(K)
N$303: IR108.A IR108.A1(A) IR109.C1(K) IR109.C(K)
N$304: IR107.A IR107.A1(A) IR108.C1(K) IR108.C(K)
N$305: IR106.A IR107.C1(K) IR107.C(K)
N$306: IR105.A IR105.A1(A) IR106.C1(K) IR106.C(K)
N$307: IR93.C1(K) IR93.C(K) IR94.A IR94.A1(A)
N$308: IR94.C1(K) IR94.C(K) IR95.A IR95.A1(A)
N$309: IR95.C1(K) IR95.C(K) IR96.A IR96.A1(A)
N$310: IR117.C(K) IR118.A IR118.A1(A)
N$311: IR118.C1(K) IR118.C(K) IR119.A IR119.A1(A)
N$312: IR119.C1(K) IR119.C(K) IR125.A IR125.A1(A)
N$313: IR120.C1(K) IR120.C(K) IR126.A IR126.A1(A)
N$314: IR126.C1(K) IR126.C(K) IR127.A IR127.A1(A)
N$315: IR127.C1(K) IR127.C(K) IR128.A
N$316: IR92.C1(K) IR92.C(K) IR93.A IR93.A1(A)
N$317: IR80.A IR80.A1(A) IR96.C1(K) IR96.C(K)
N$318: IR120.A IR120.A1(A) IR125.C1(K) IR125.C(K)
N$319: IR112.A IR112.A1(A) IR128.C(K)
N$320: IR73.C1(K) IR73.C(K) R38.1
N$321: IR105.C1(K) IR105.C(K) R45.1
N$322: Q6.3(E2) R11.2 R14.1 U4.4(IN-)
N$323: D3.A L2.2 U12.5(SW) U12.6(SW1)
N$324: Q5.3(E2) R9.2 R21.1 U7.4(IN-)
N$325: Q5.2(B1) Q5.4(B2) U7.1(OUT)
N$326: LB13.GC(K) LB14.GA(A)
N$327: LG14.GC(K) LG15.GA(A)
N$328: LR14.GC(K) LR15.GA(A)
N$329: LB14.GC(K) LB15.GA(A)
N$330: LG15.GC(K) LG16.GA(A)
N$331: LR15.GC(K) LR16.GA(A)
N$332: LB15.GC(K) LB16.GA(A)
N$333: LG8.GA(A) LG16.GC(K)
N$334: LR8.GA(A) LR16.GC(K)
N$335: LG29.GC(K) LG30.GA(A)
N$336: LR29.GC(K) LR30.GA(A)
N$338: LB29.GC(K) LB30.GA(A)
N$339: LG30.GC(K) LG31.GA(A)
N$340: LR30.GC(K) LR31.GA(A)
N$341: LB30.GC(K) LB31.GA(A)
N$342: LG31.GC(K) LG32.GA(A)
N$343: LR31.GC(K) LR32.GA(A)
N$344: LB31.GC(K) LB32.GA(A)
N$345: LG24.GA(A) LG32.GC(K)
N$346: LR24.GA(A) LR32.GC(K)
N$348: Q3.3(E2) R1.2 R20.1 U5.4(IN-)
N$349: Q3.2(B1) Q3.4(B2) U5.1(OUT)
N$351: LB24.GA(A) LB32.GC(K)
N$352: LB8.GA(A) LB16.GC(K)
N$353: LB5.GA(A) LB6.GC(K)
N$354: LR5.GA(A) LR6.GC(K)
N$355: LG5.GA(A) LG6.GC(K)
N$356: LB6.GA(A) LB7.GC(K)
N$357: LR6.GA(A) LR7.GC(K)
N$358: LG6.GA(A) LG7.GC(K)
N$359: LG7.GA(A) LG8.GC(K)
N$360: LR7.GA(A) LR8.GC(K)
N$361: LB7.GA(A) LB8.GC(K)
N$363: LG23.GA(A) LG24.GC(K)
N$364: LR23.GA(A) LR24.GC(K)
N$365: LB23.GA(A) LB24.GC(K)
N$366: LG22.GA(A) LG23.GC(K)
N$367: LR22.GA(A) LR23.GC(K)
N$368: LB22.GA(A) LB23.GC(K)
N$369: LG21.GA(A) LG22.GC(K)
N$370: LR21.GA(A) LR22.GC(K)
N$371: LB21.GA(A) LB22.GC(K)
N$372: Q6.2(B1) Q6.4(B2) U4.1(OUT)
N$374: Q6.1(E1) R12.2
N$375: Q5.1(E1) R10.2
N$378: Q3.1(E1) R2.2
N$552: LB13.T(TH) LG13.T(TH) LR13.T(TH) V13.T1(TH) V13.T2(TH) V13.T3(TH) V13.T4(TH) V13.T5(TH) V13.T6(TH)
N$553: LB14.T(TH) LG14.T(TH) LR14.T(TH) V14.T1(TH) V14.T2(TH) V14.T3(TH) V14.T4(TH) V14.T5(TH) V14.T6(TH)
N$554: LB15.T(TH) LG15.T(TH) LR15.T(TH) V15.T1(TH) V15.T2(TH) V15.T3(TH) V15.T4(TH) V15.T5(TH) V15.T6(TH)
N$555: LB5.T(TH) LG5.T(TH) LR5.T(TH) V5.T1(TH) V5.T2(TH) V5.T3(TH) V5.T4(TH) V5.T5(TH) V5.T6(TH)
N$556: LB8.T(TH) LG8.T(TH) LR8.T(TH) V8.T1(TH) V8.T2(TH) V8.T3(TH)
N$557: LB29.T(TH) LG29.T(TH) LR29.T(TH) V29.T1(TH) V29.T2(TH) V29.T3(TH) V29.T4(TH) V29.T5(TH) V29.T6(TH)
N$558: LB30.T(TH) LG30.T(TH) LR30.T(TH) V30.T1(TH) V30.T2(TH) V30.T3(TH) V30.T4(TH) V30.T5(TH) V30.T6(TH)
N$559: LB31.T(TH) LG31.T(TH) LR31.T(TH) V31.T1(TH) V31.T2(TH) V31.T3(TH) V31.T4(TH) V31.T5(TH) V31.T6(TH)
N$560: LB24.T(TH) LG24.T(TH) LR24.T(TH) V24.T1(TH) V24.T2(TH) V24.T3(TH)
N$561: LB23.T(TH) LG23.T(TH) LR23.T(TH) V23.T1(TH) V23.T2(TH) V23.T3(TH) V23.T4(TH) V23.T5(TH) V23.T6(TH)
N$562: LB21.T(TH) LG21.T(TH) LR21.T(TH) V21.T1(TH) V21.T2(TH) V21.T3(TH) V21.T4(TH) V21.T5(TH) V21.T6(TH)
N$563: LB6.T(TH) LG6.T(TH) LR6.T(TH) V6.T1(TH) V6.T2(TH) V6.T3(TH) V6.T4(TH) V6.T5(TH) V6.T6(TH)
Q7A: LG21.GC(K) Q6.7(C1) Q6.8(C1) Q6.8A(C1) Q6.8B(C1) Q6.8C1(C1) Q6.8C2(C1) Q6.8C3(C1) Q6.8C(C1) Q6.78(C1) Q6.78A(C1) Q6.78B(C1)
Q7B: LG5.GC(K) Q6.5(C2) Q6.5A1(C2) Q6.5A(C2) Q6.5B(C2) Q6.5C1(C2) Q6.5C2(C2) Q6.5C(C2) Q6.6(C2) Q6.56(C2) Q6.56A(C2) Q6.56B(C2)
Q8A: LR21.GC(K) Q5.7(C1) Q5.8(C1) Q5.8A(C1) Q5.8B(C1) Q5.8C1(C1) Q5.8C2(C1) Q5.8C3(C1) Q5.8C(C1) Q5.78(C1) Q5.78A(C1) Q5.78B(C1)
Q8B: LR5.GC(K) Q5.5(C2) Q5.5A1(C2) Q5.5A(C2) Q5.5B(C2) Q5.5C1(C2) Q5.5C2(C2) Q5.5C(C2) Q5.6(C2) Q5.56(C2) Q5.56A(C2) Q5.56B(C2)
Q9A: LB21.GC(K) Q3.7(C1) Q3.8(C1) Q3.8A(C1) Q3.8B(C1) Q3.8C1(C1) Q3.8C2(C1) Q3.8C3(C1) Q3.8C(C1) Q3.78(C1) Q3.78A(C1) Q3.78B(C1)
Q9B: LB5.GC(K) Q3.5(C2) Q3.5A1(C2) Q3.5A(C2) Q3.5B(C2) Q3.5C1(C2) Q3.5C2(C2) Q3.5C(C2) Q3.6(C2) Q3.56(C2) Q3.56A(C2) Q3.56B(C2)
RED_UR: U7.3(IN+) U10.4(VO_C)
SCLK: U10.7(SCLK) ; also sheet 1,2,4
TH9: LB7.T(TH) LG7.T(TH) LR7.T(TH) V7.T1(TH) V7.T2(TH) V7.T3(TH) V7.T4(TH) V7.T5(TH) V7.T6(TH)
TH12: LB16.T(TH) LG16.T(TH) LR16.T(TH) V16.T1(TH) V16.T2(TH) V16.T3(TH)
TH16: LB32.T(TH) LG32.T(TH) LR32.T(TH) V32.T1(TH) V32.T2(TH) V32.T3(TH)
TH17: LB22.T(TH) LG22.T(TH) LR22.T(TH) V22.T1(TH) V22.T2(TH) V22.T3(TH) V22.T4(TH) V22.T5(TH) V22.T6(TH)
UR_EN: U10.6(!SYNC) ; also sheet 1
V_IR: C13.1 D3.K R23.2 U12.4(VIN) ; also sheet 1,2,4
V_RGB: C1.1 C2.1 C14.1 LB13.GA(A) LB29.GA(A) LG13.GA(A) LG29.GA(A) LR13.GA(A) LR29.GA(A) R14.2 R20.2 R21.2 ; also sheet 1,2,4
Unconnected: U12.3(N/C)

### Notes on the sheet
- UR